# EasyEDA Pro project CanMV-K230-LP4-V3.0-立创文件.epro, schematic CanMV-K230-LP4-V3.0_20240509

## Sheets
1 K230: Create Date: 2025-10-27; Page Name: K230; Project Name: CanMV-K230; Schematic Name: CanMV-K230-LP4-V3.0_7; Update Date: 2025-10-27; Company: 嘉立创EDA; Page Size: A3; Version: V1.0
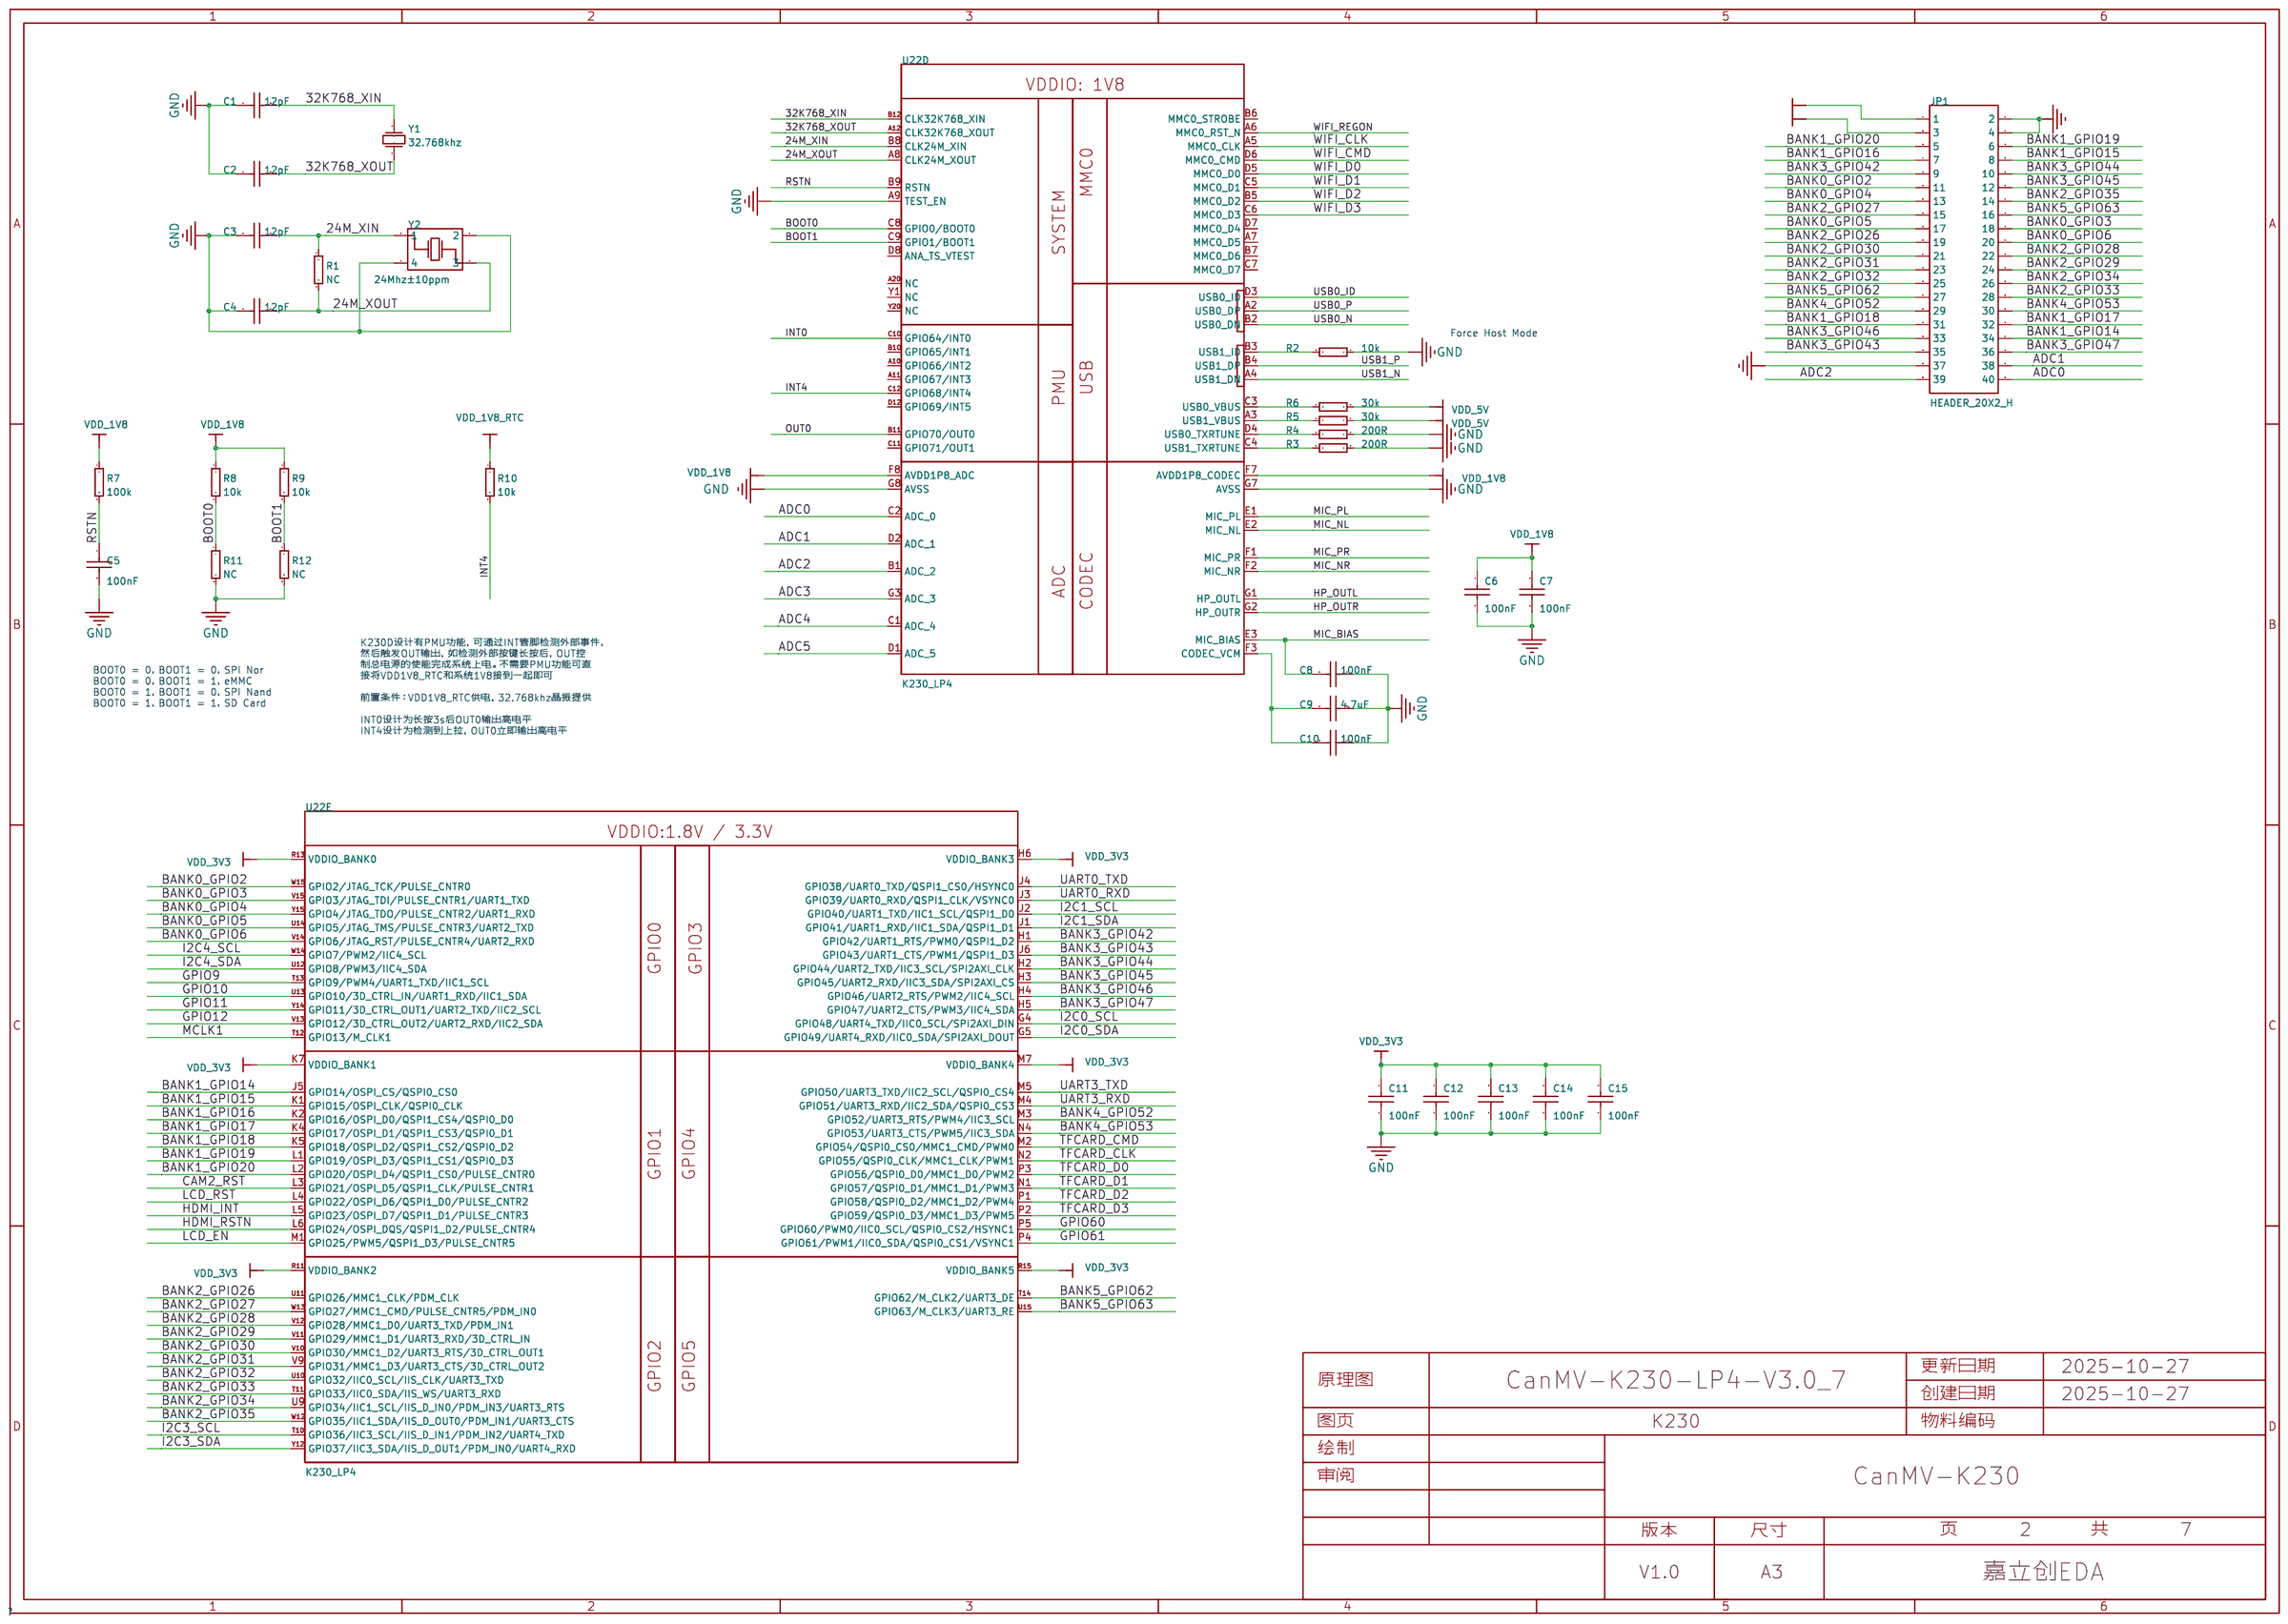
[diagram p0: K230]
2 LPDDR4: Page Name: LPDDR4
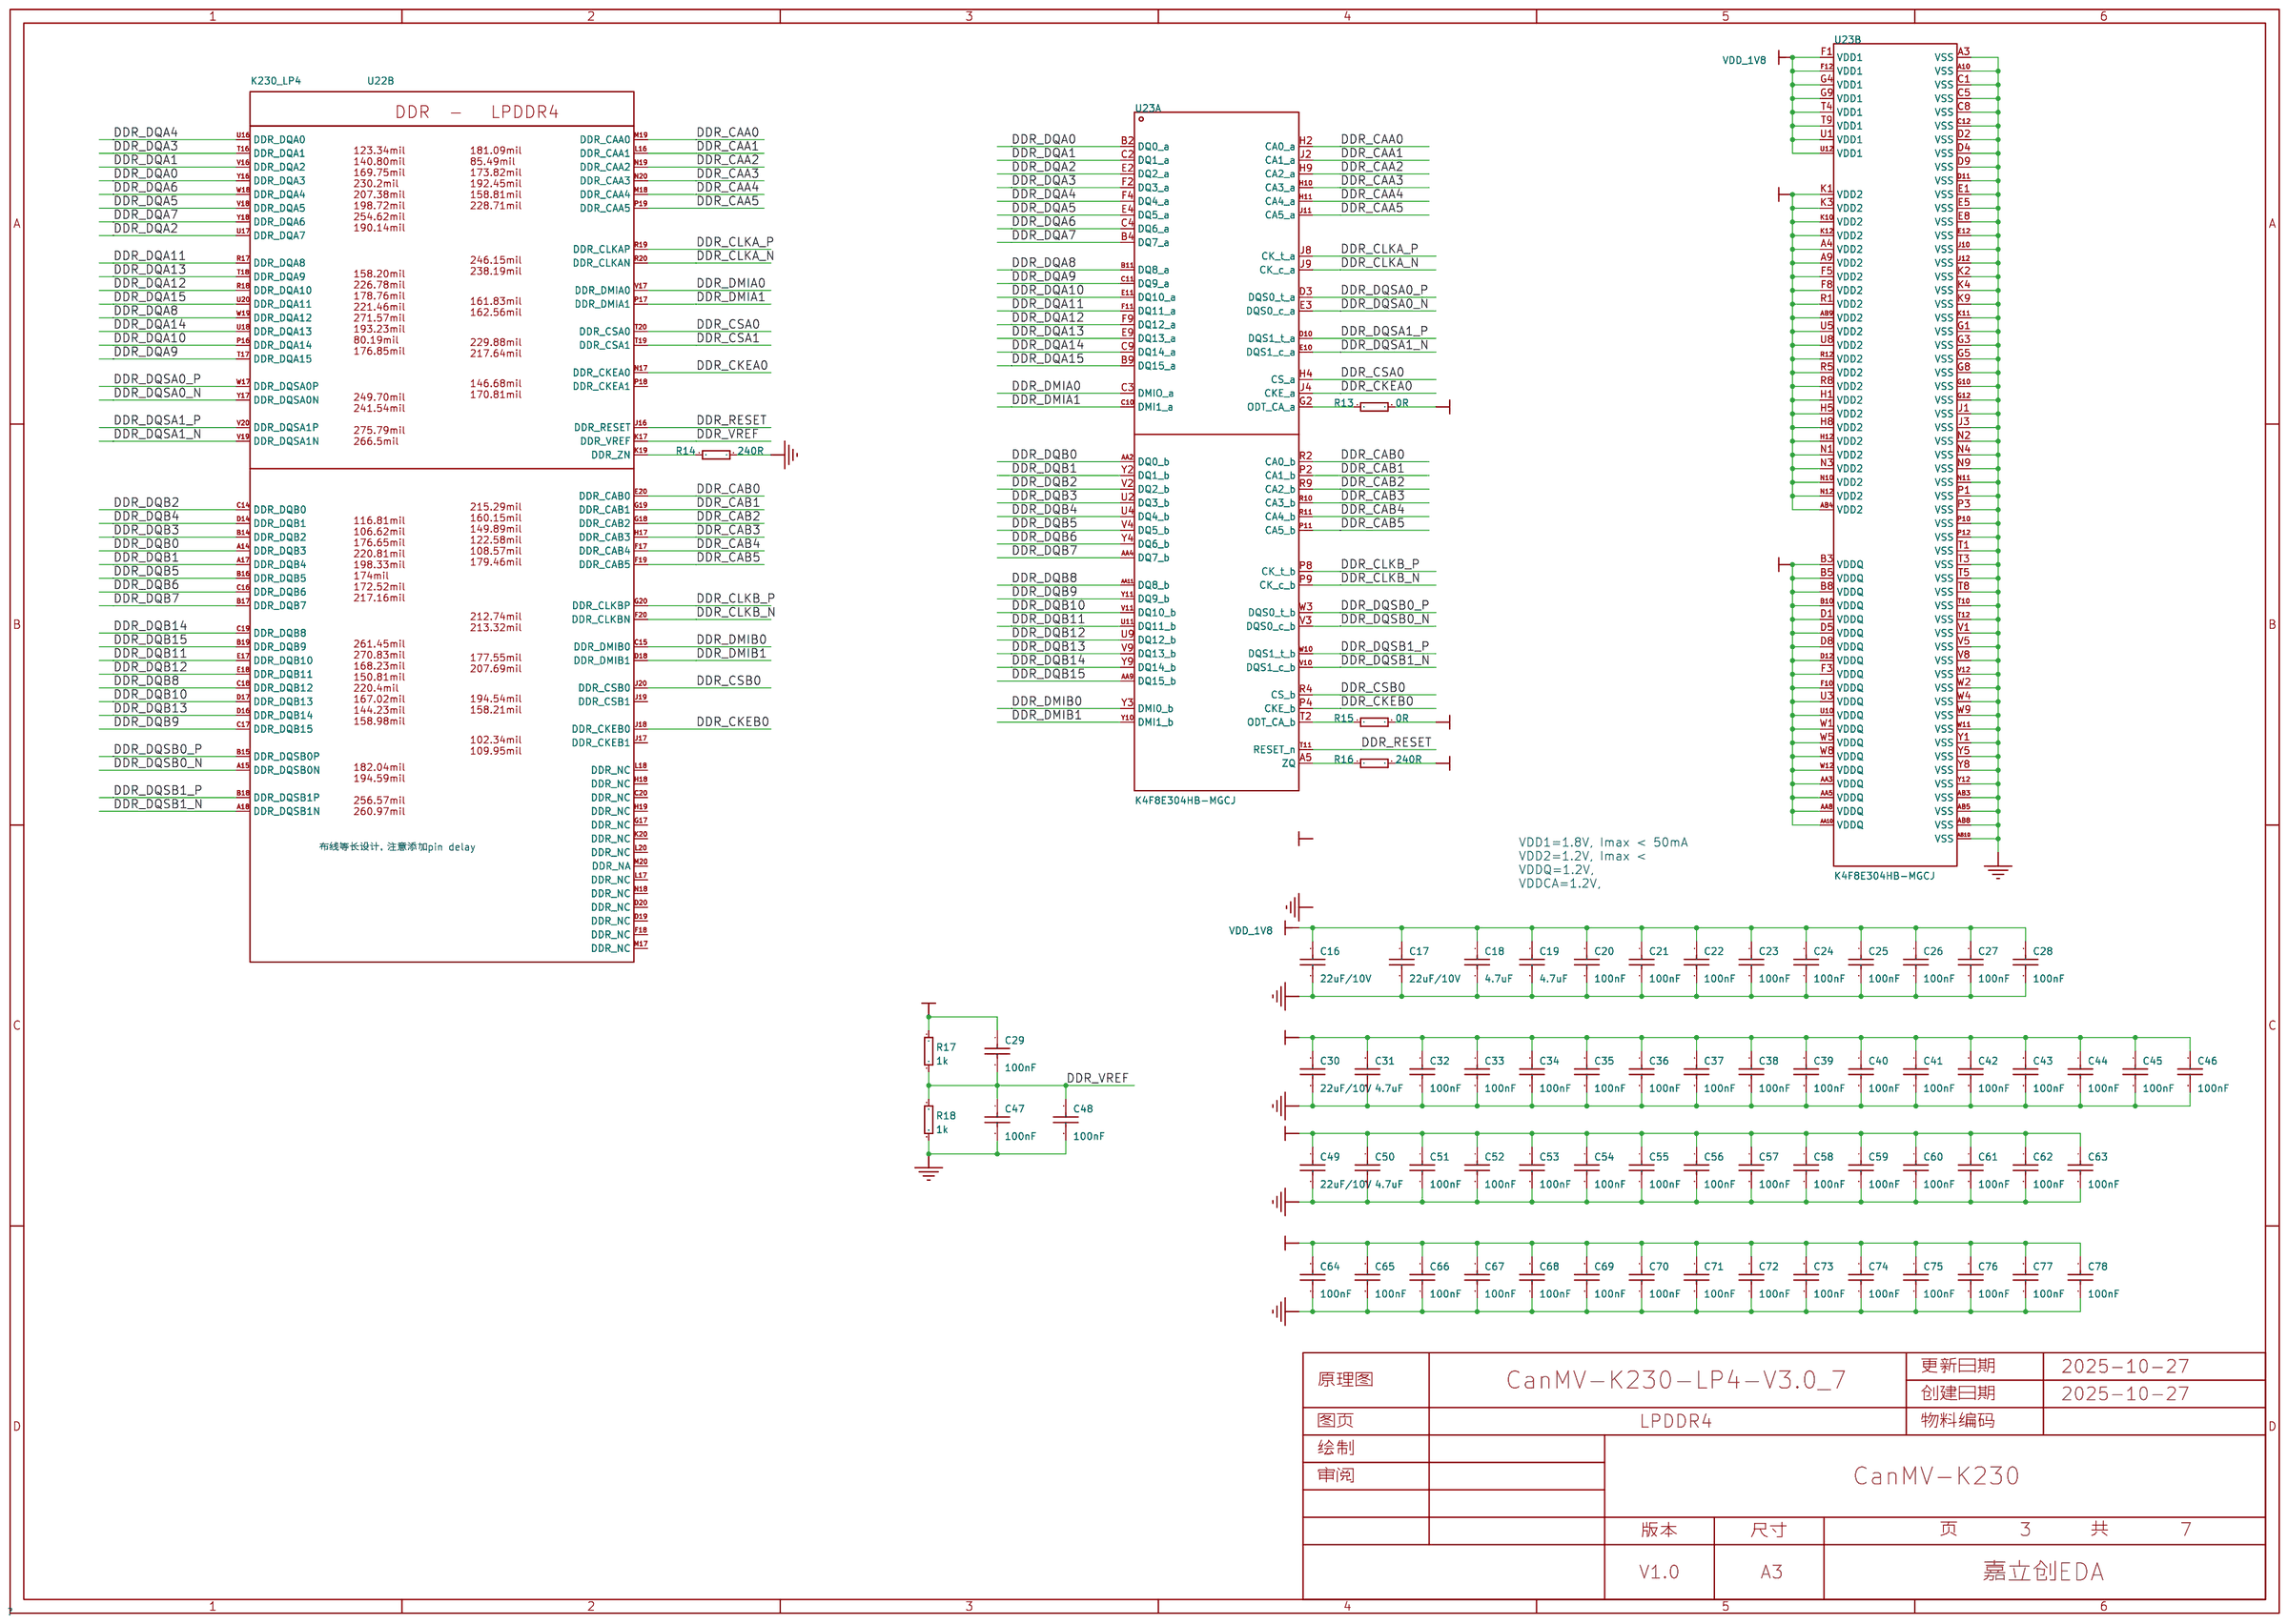
[diagram p1: LPDDR4]
3 Power-K230: Page Name: Power-K230
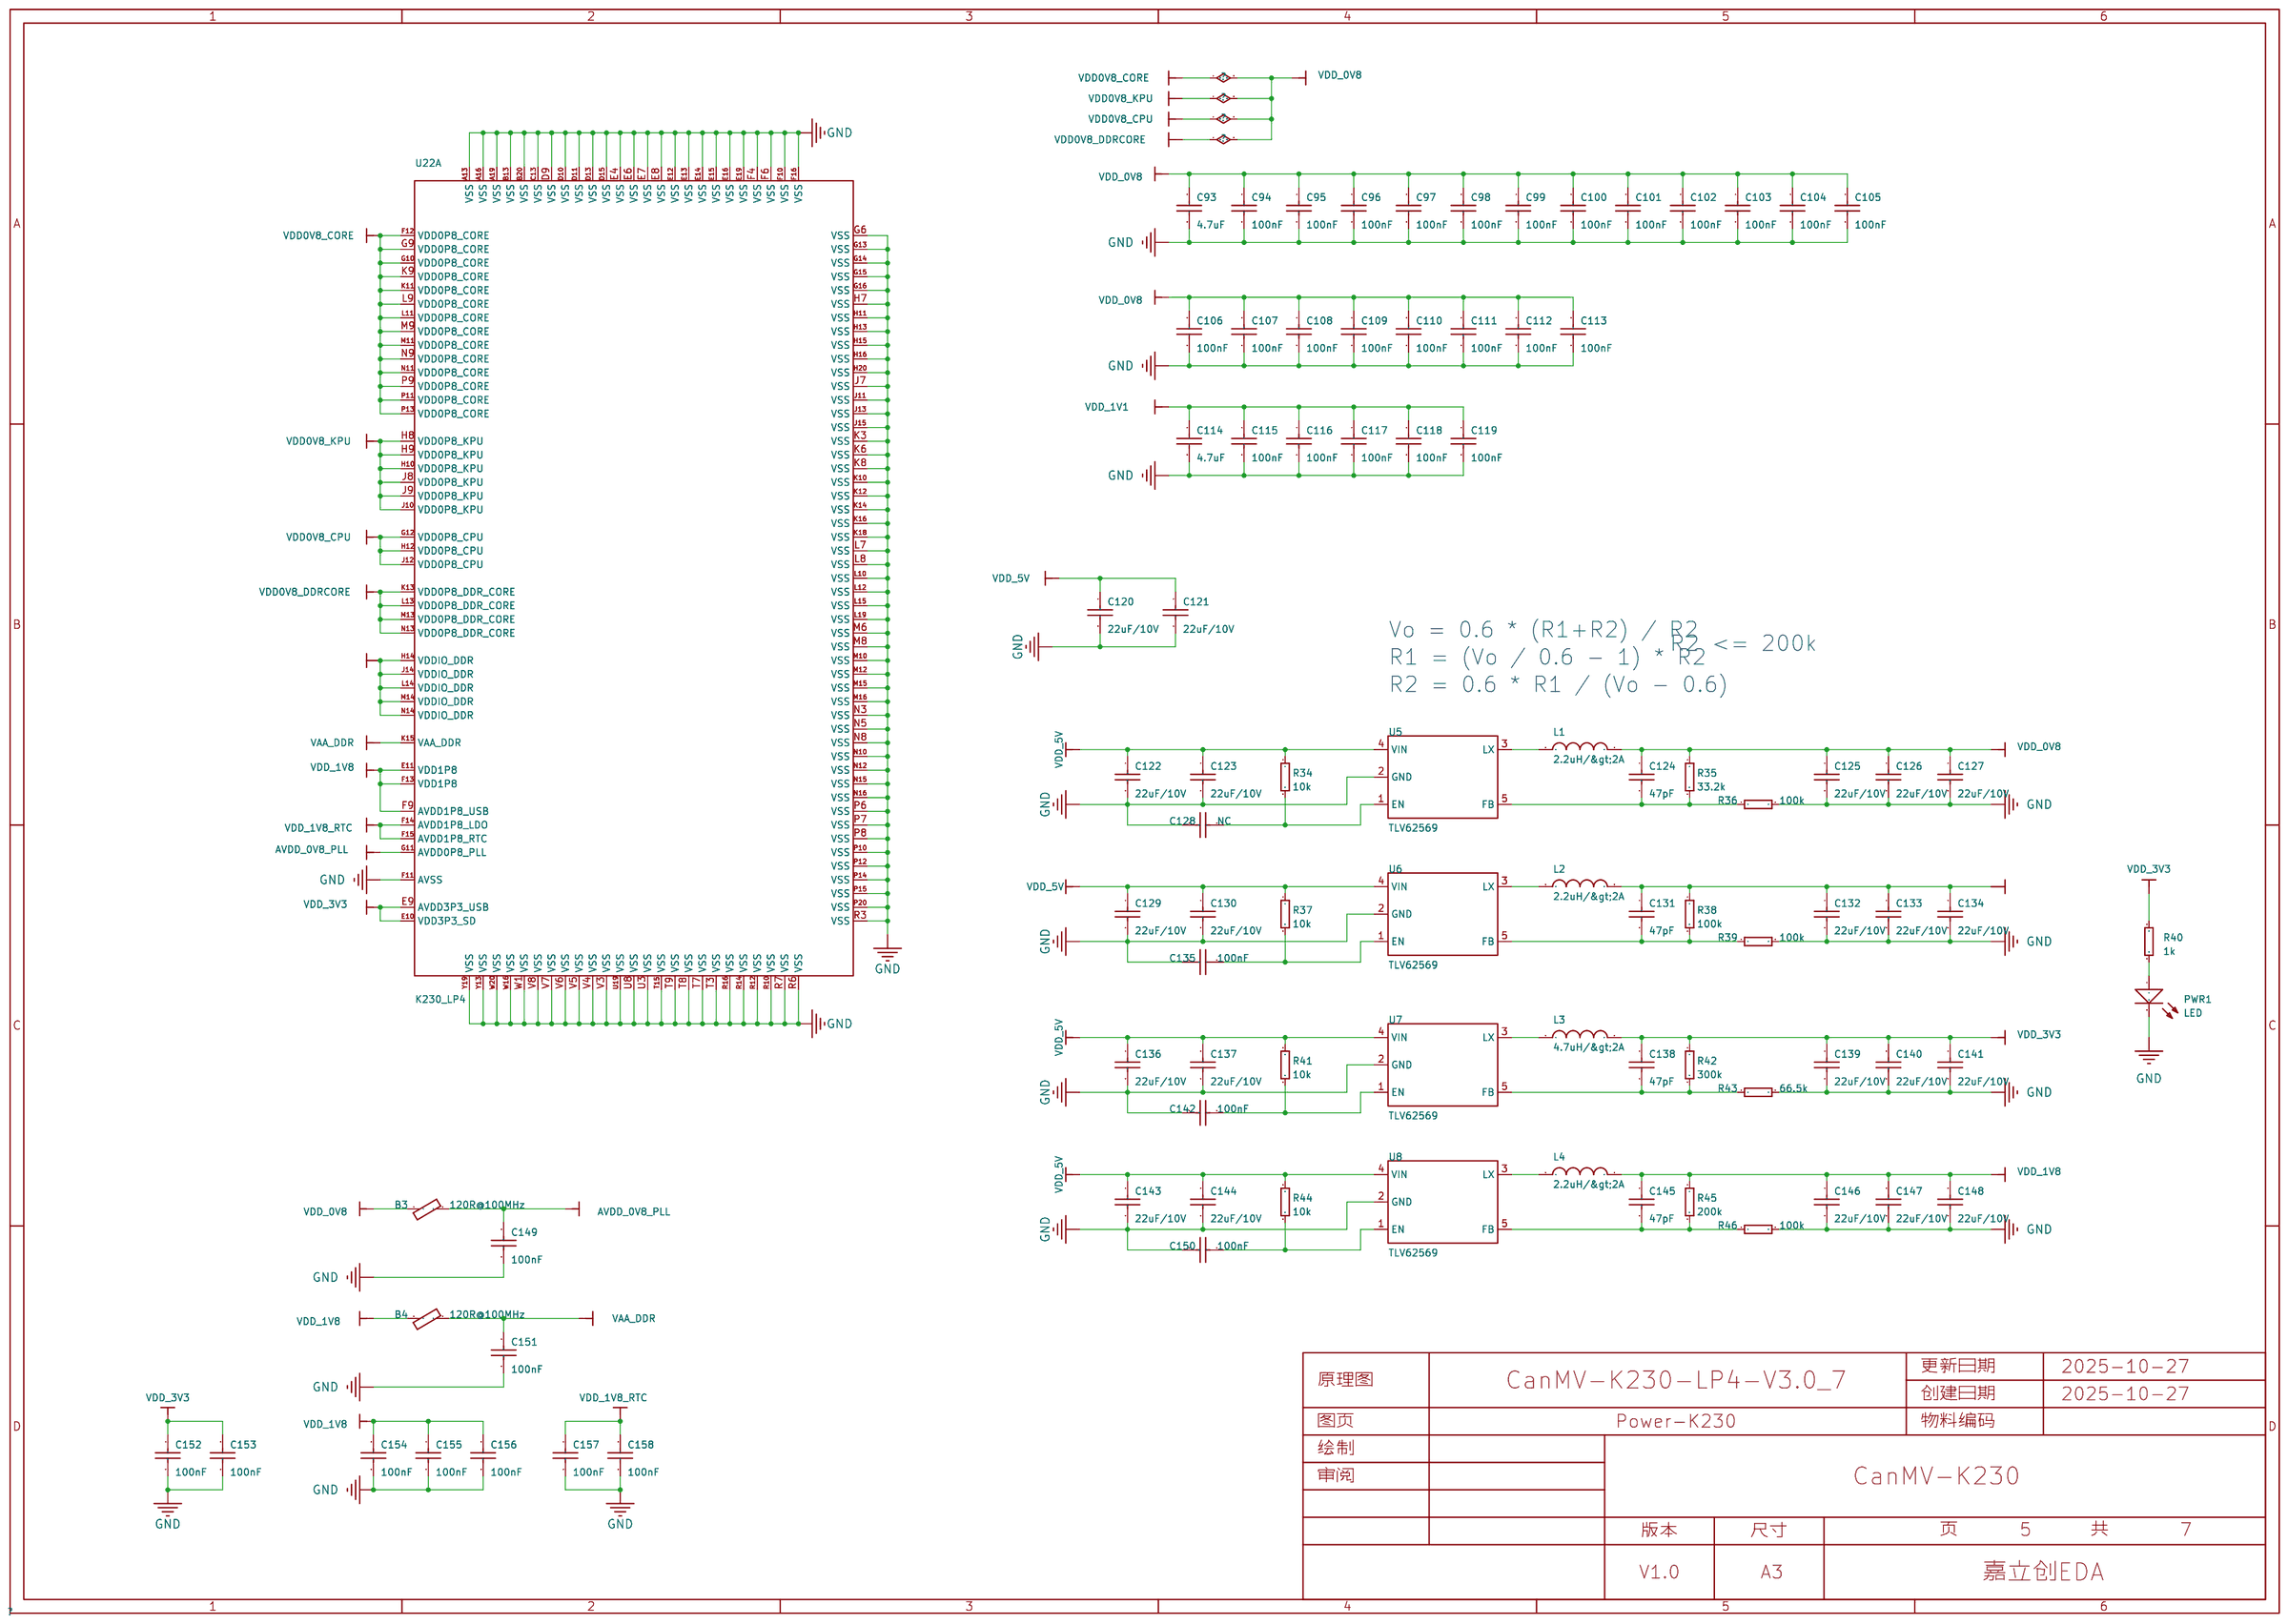
[diagram p2: Power-K230]
4 Peripherial: Create Date: 2026-07-16; Page Name: Peripherial; Update Date: 2026-07-16
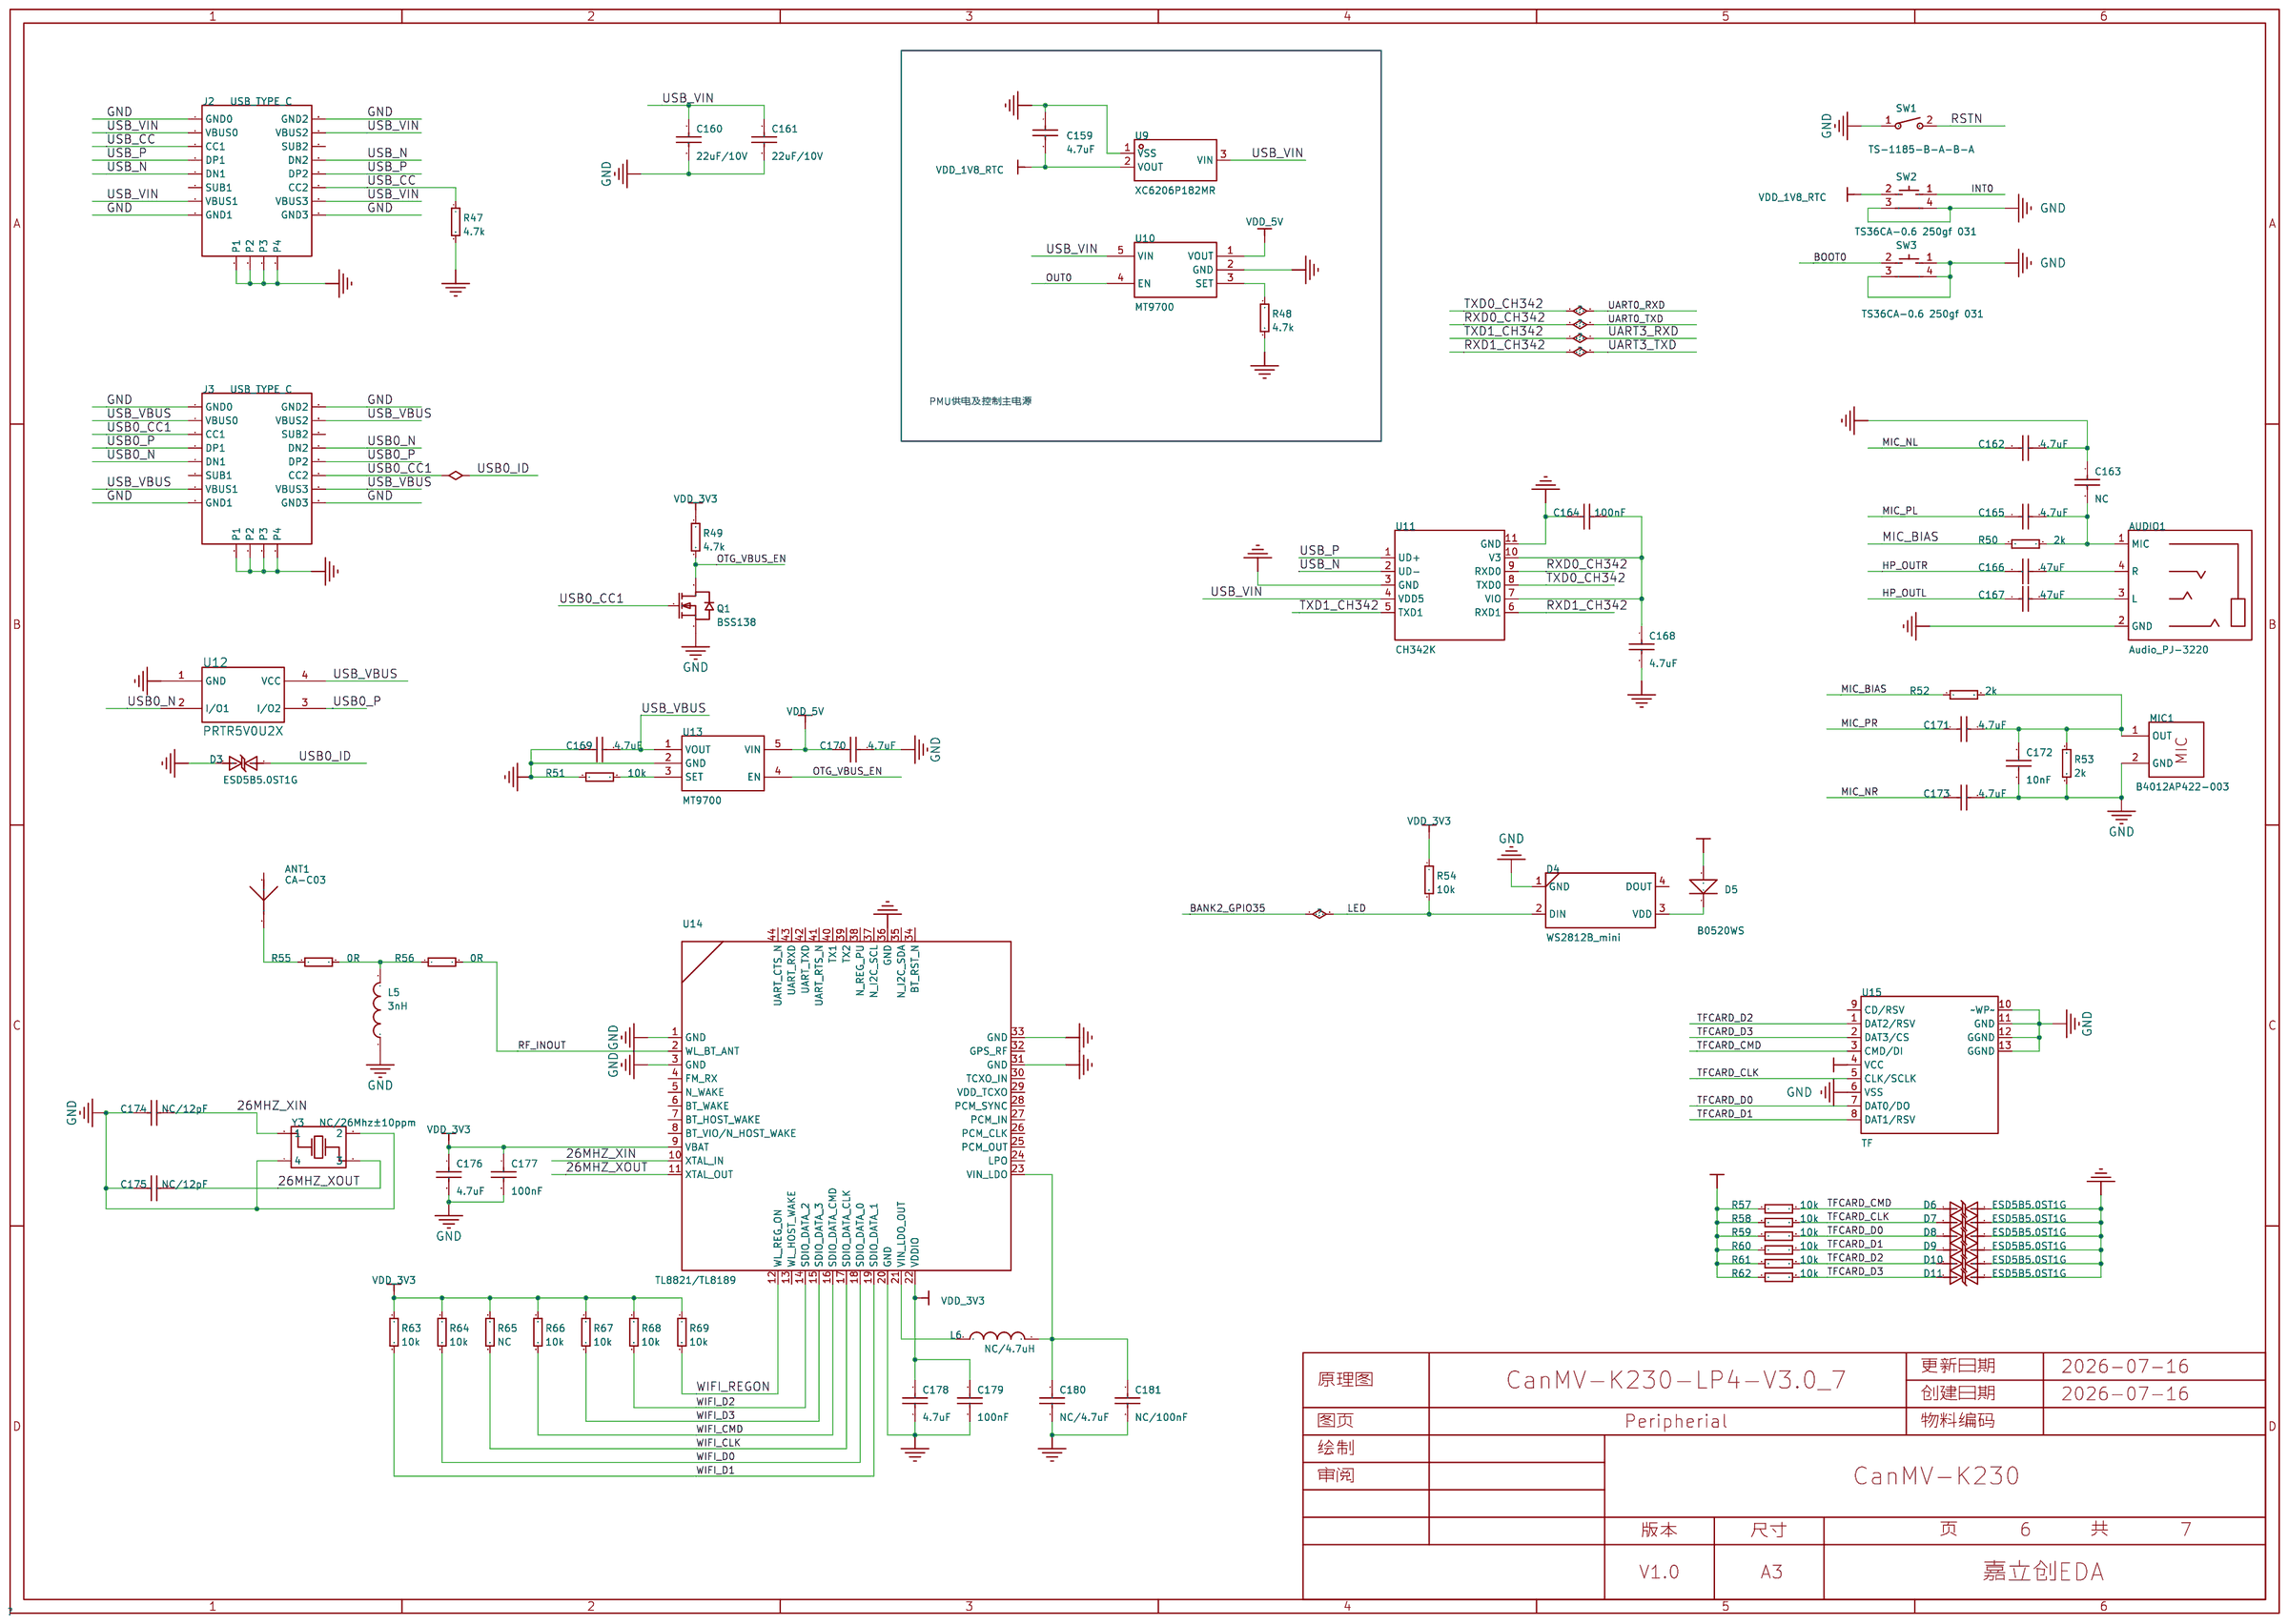
[diagram p3: Peripherial]
5 Video: Page Name: Video
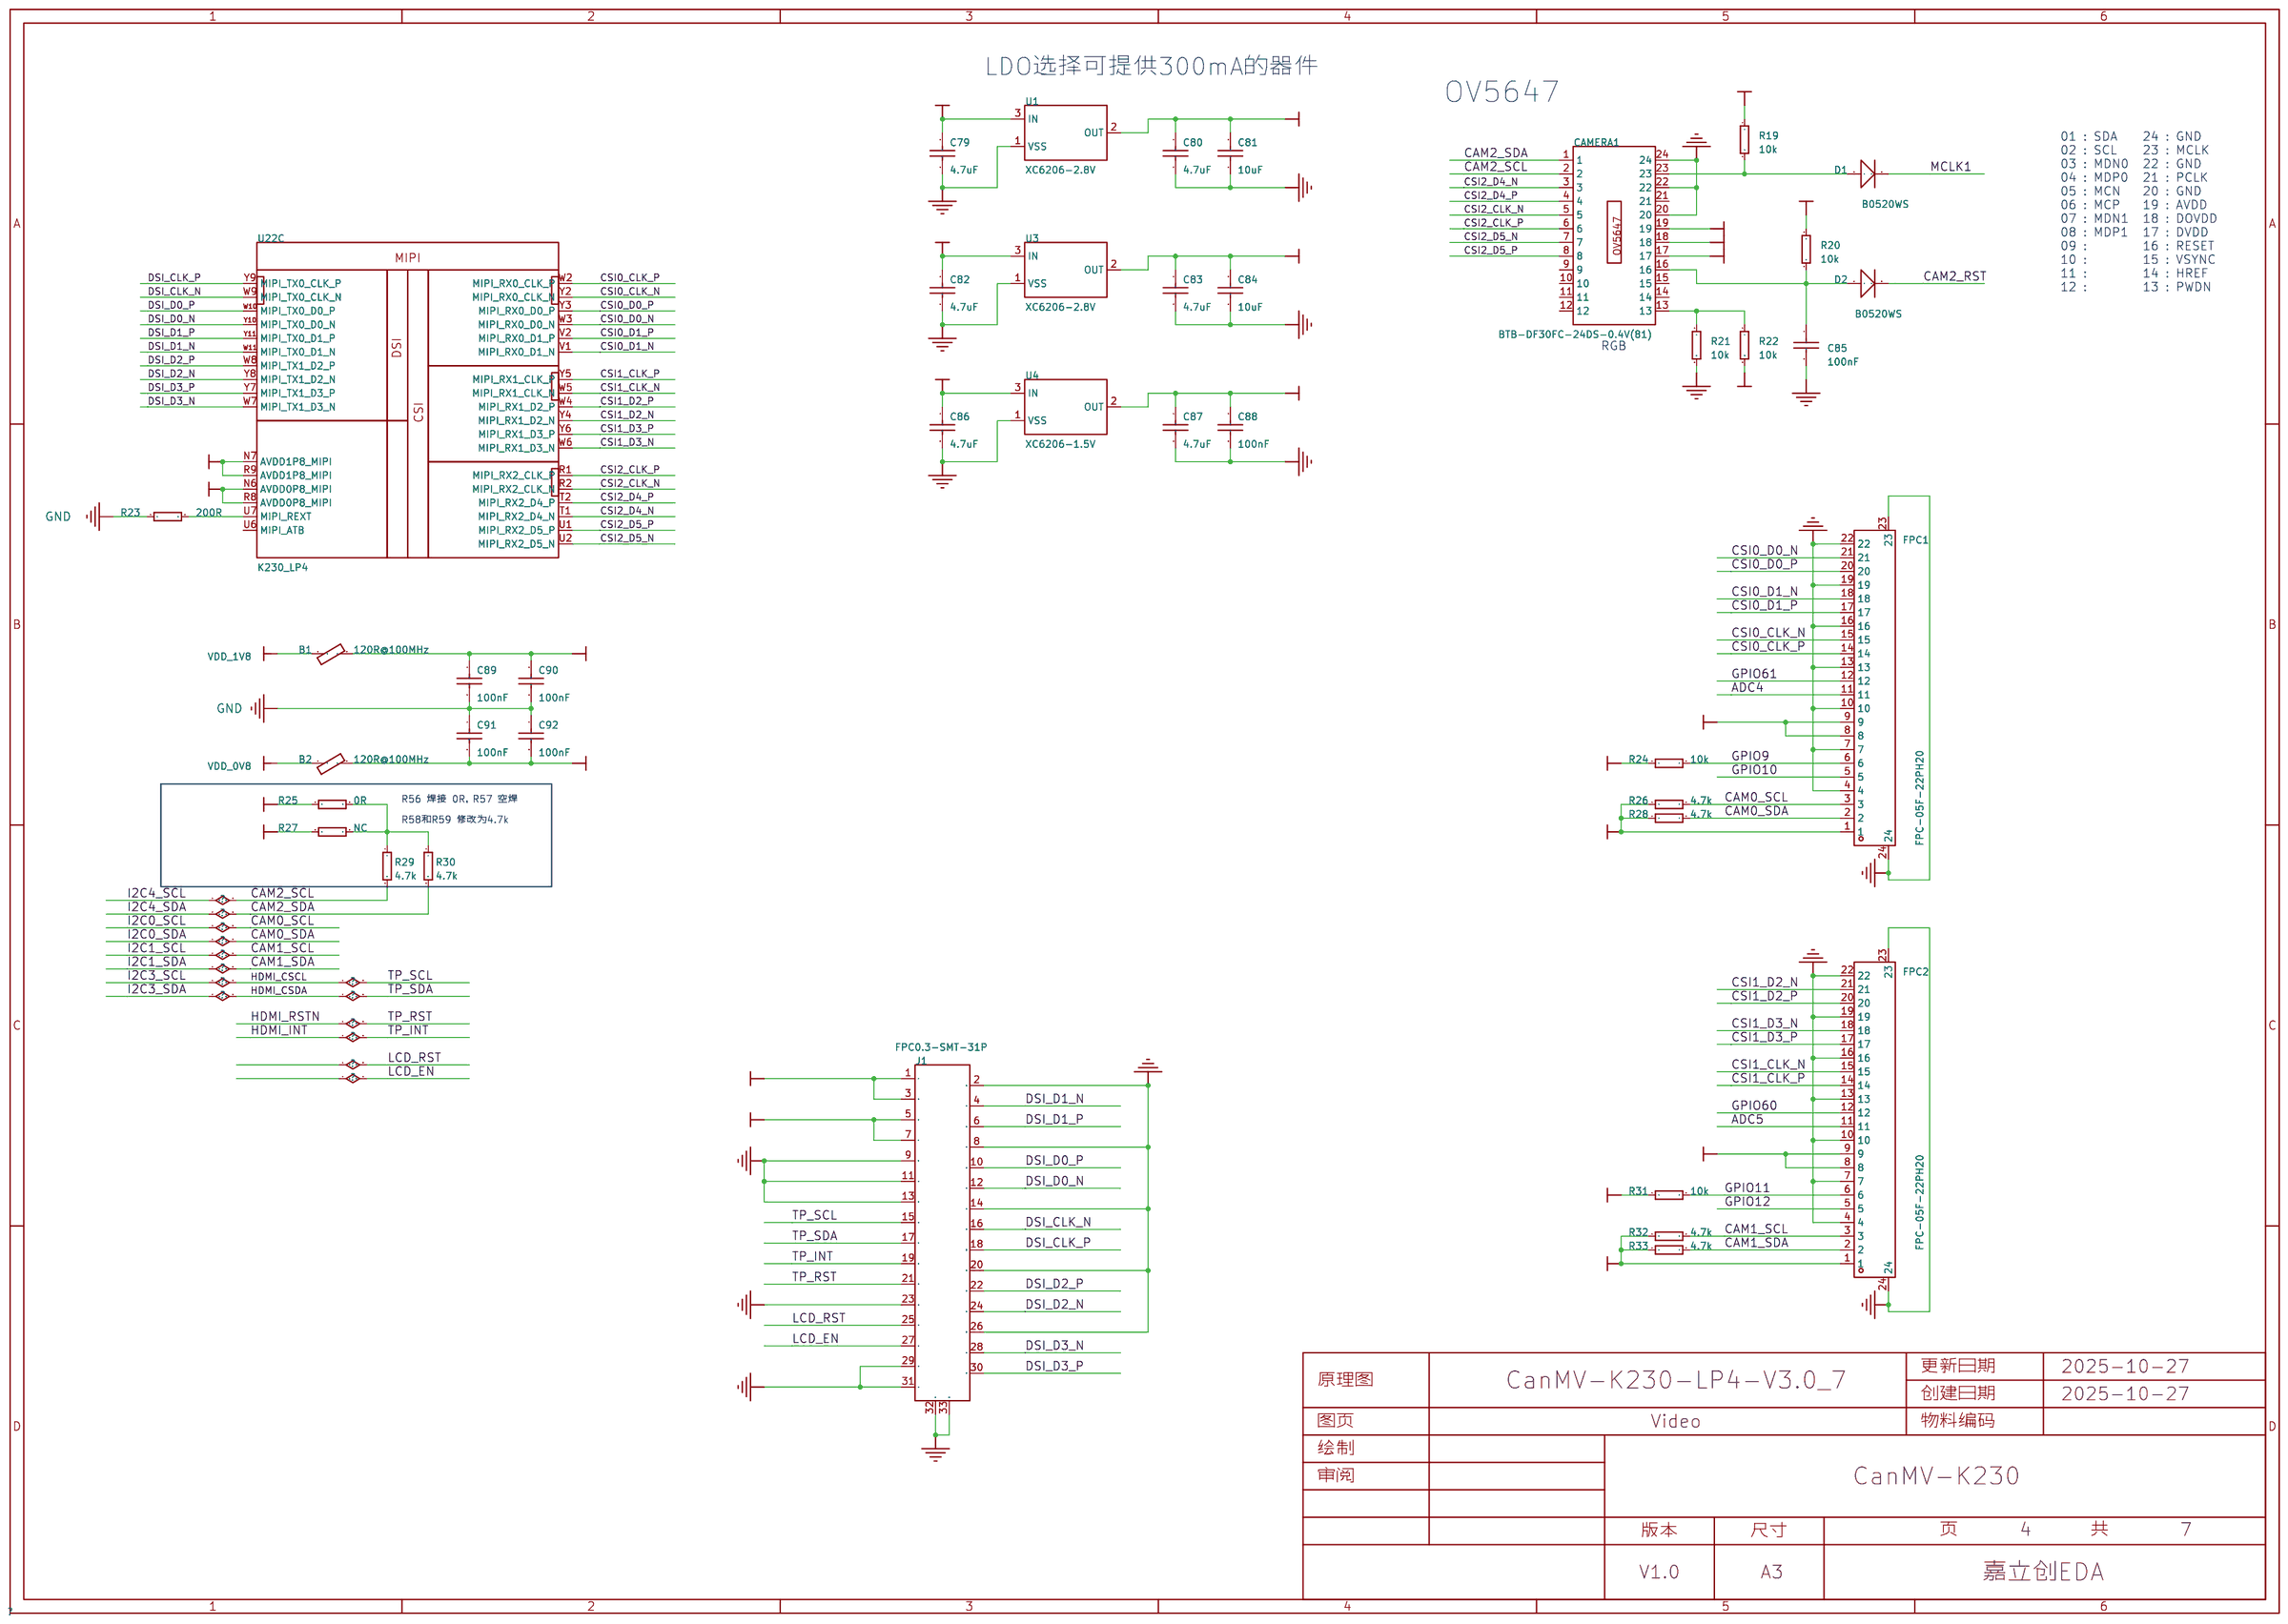
[diagram p4: Video]
6 HDMI+ETH: Page Name: HDMI+ETH; Schematic Name: CanMV-K230-LP4-V3.0_6
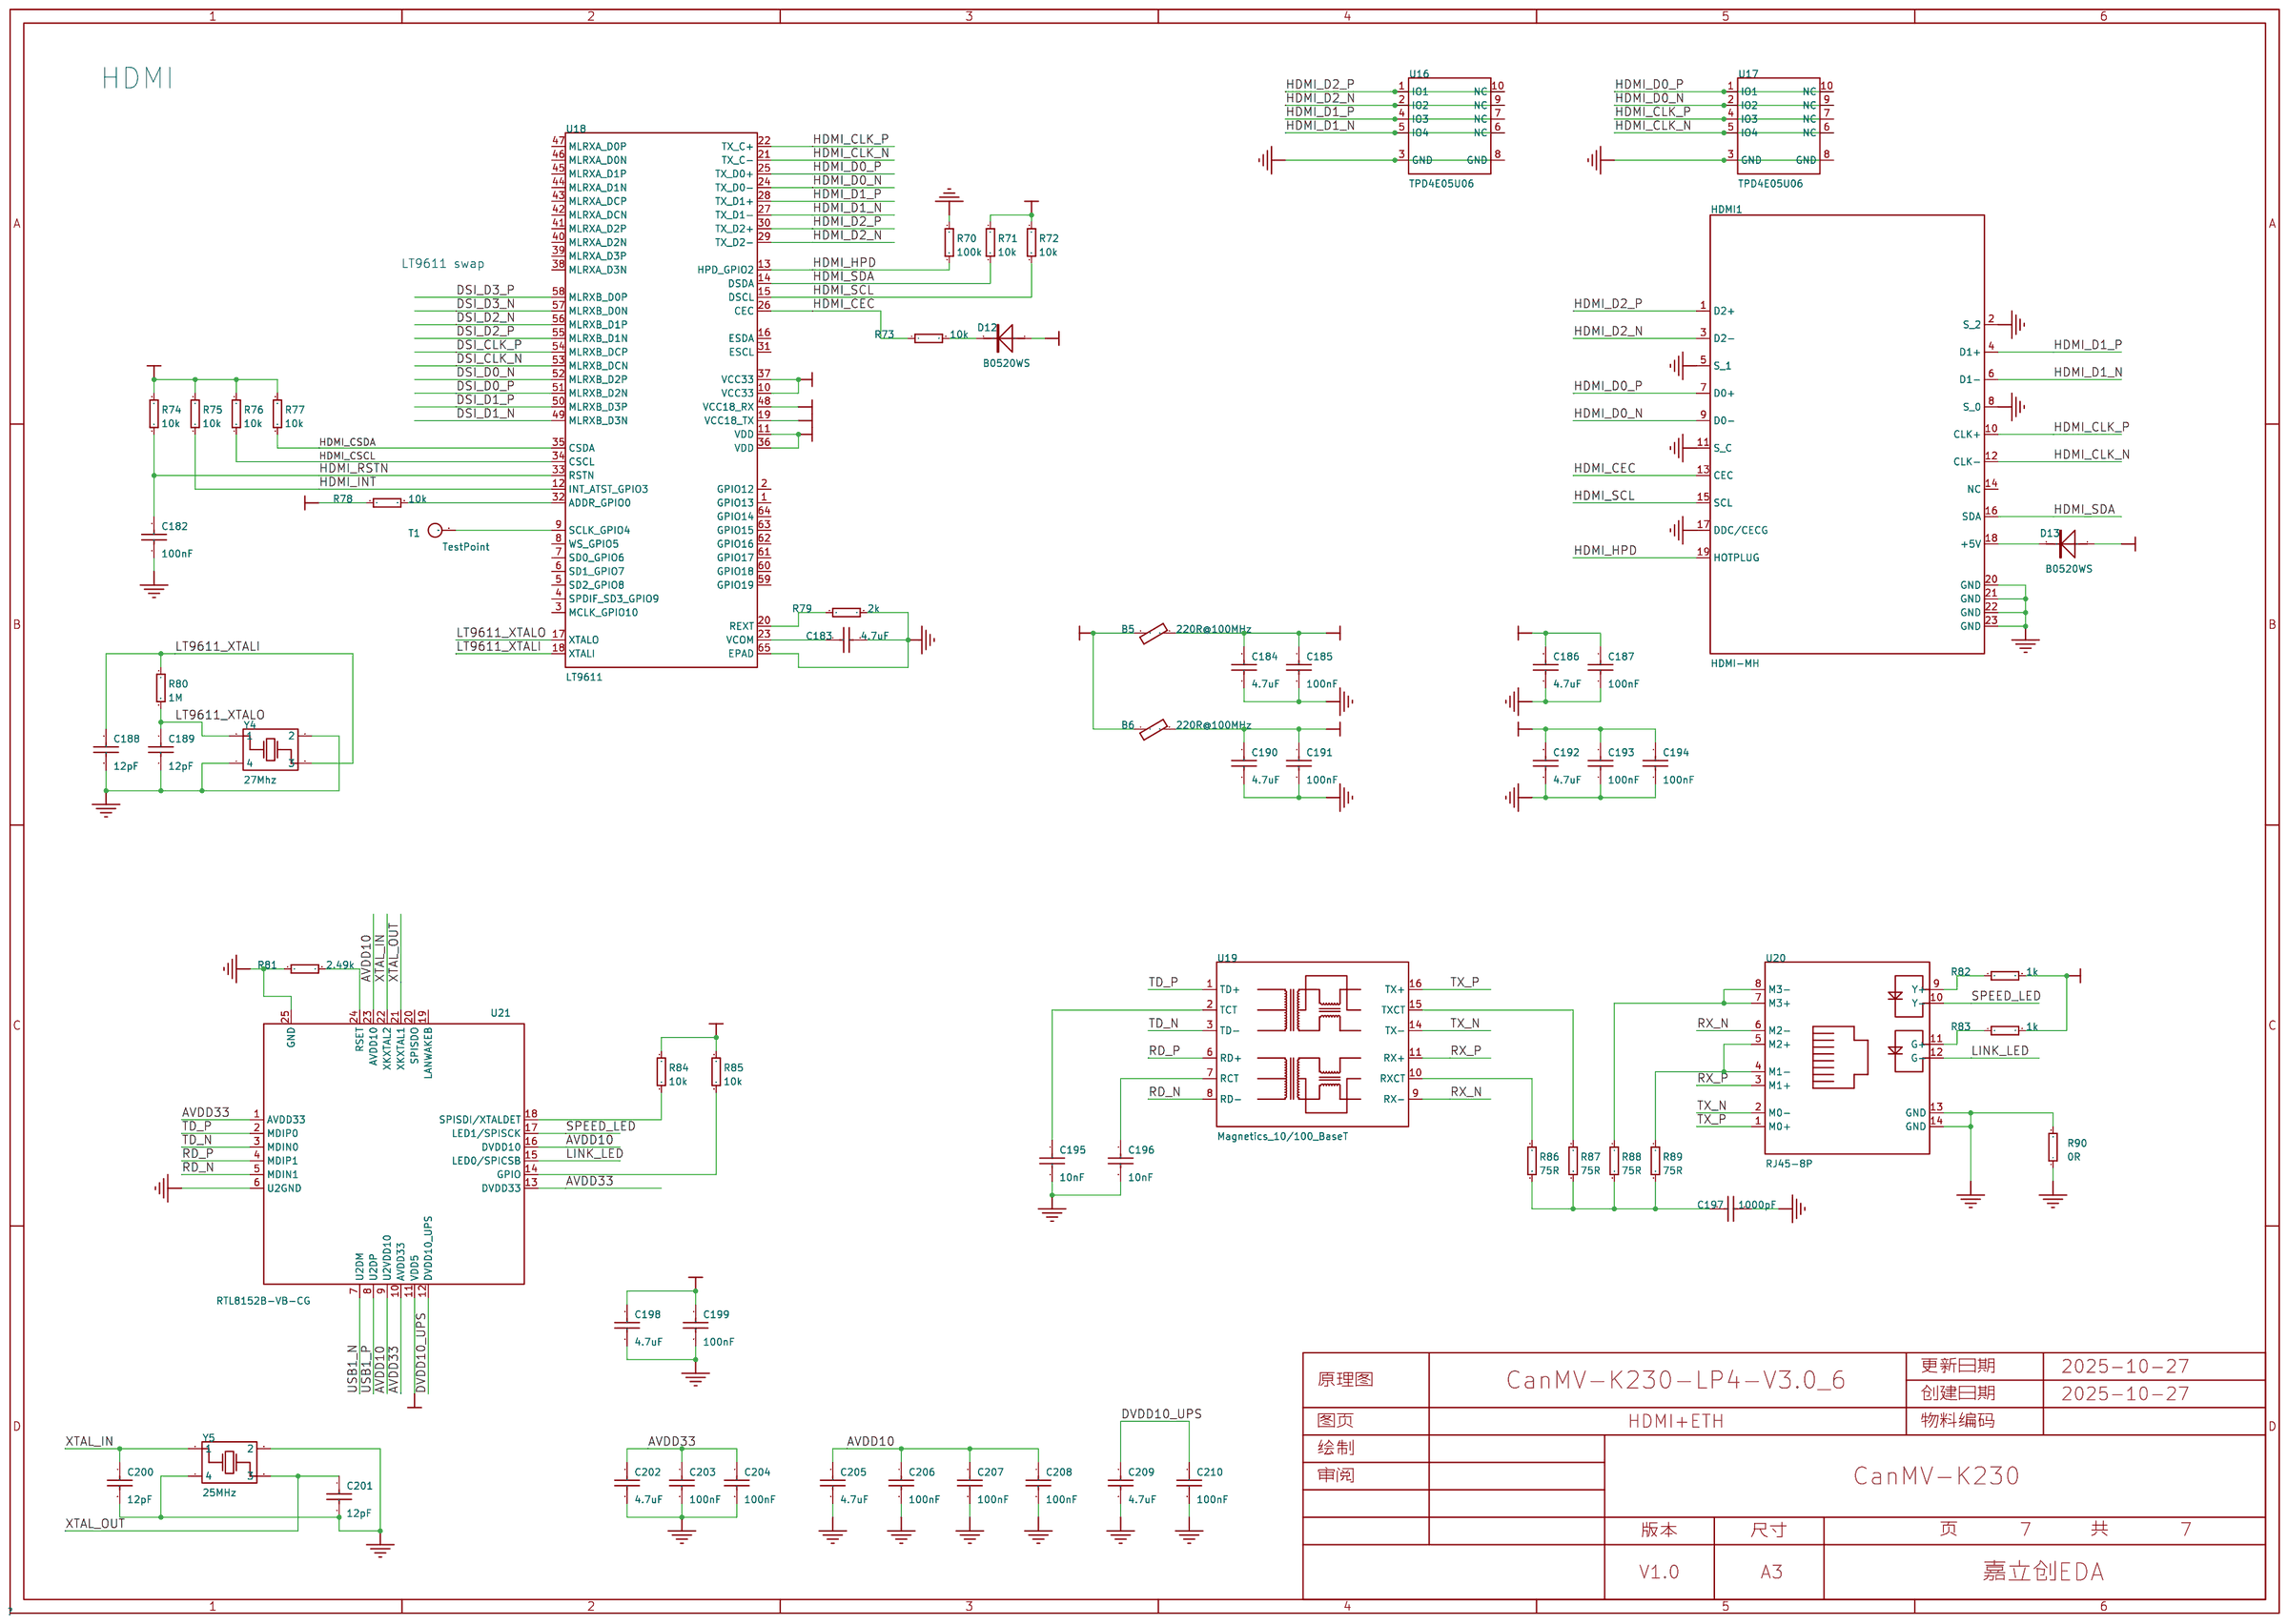
[diagram p5: HDMI+ETH]
7 P1: Page Name: P1; Page Size: A4
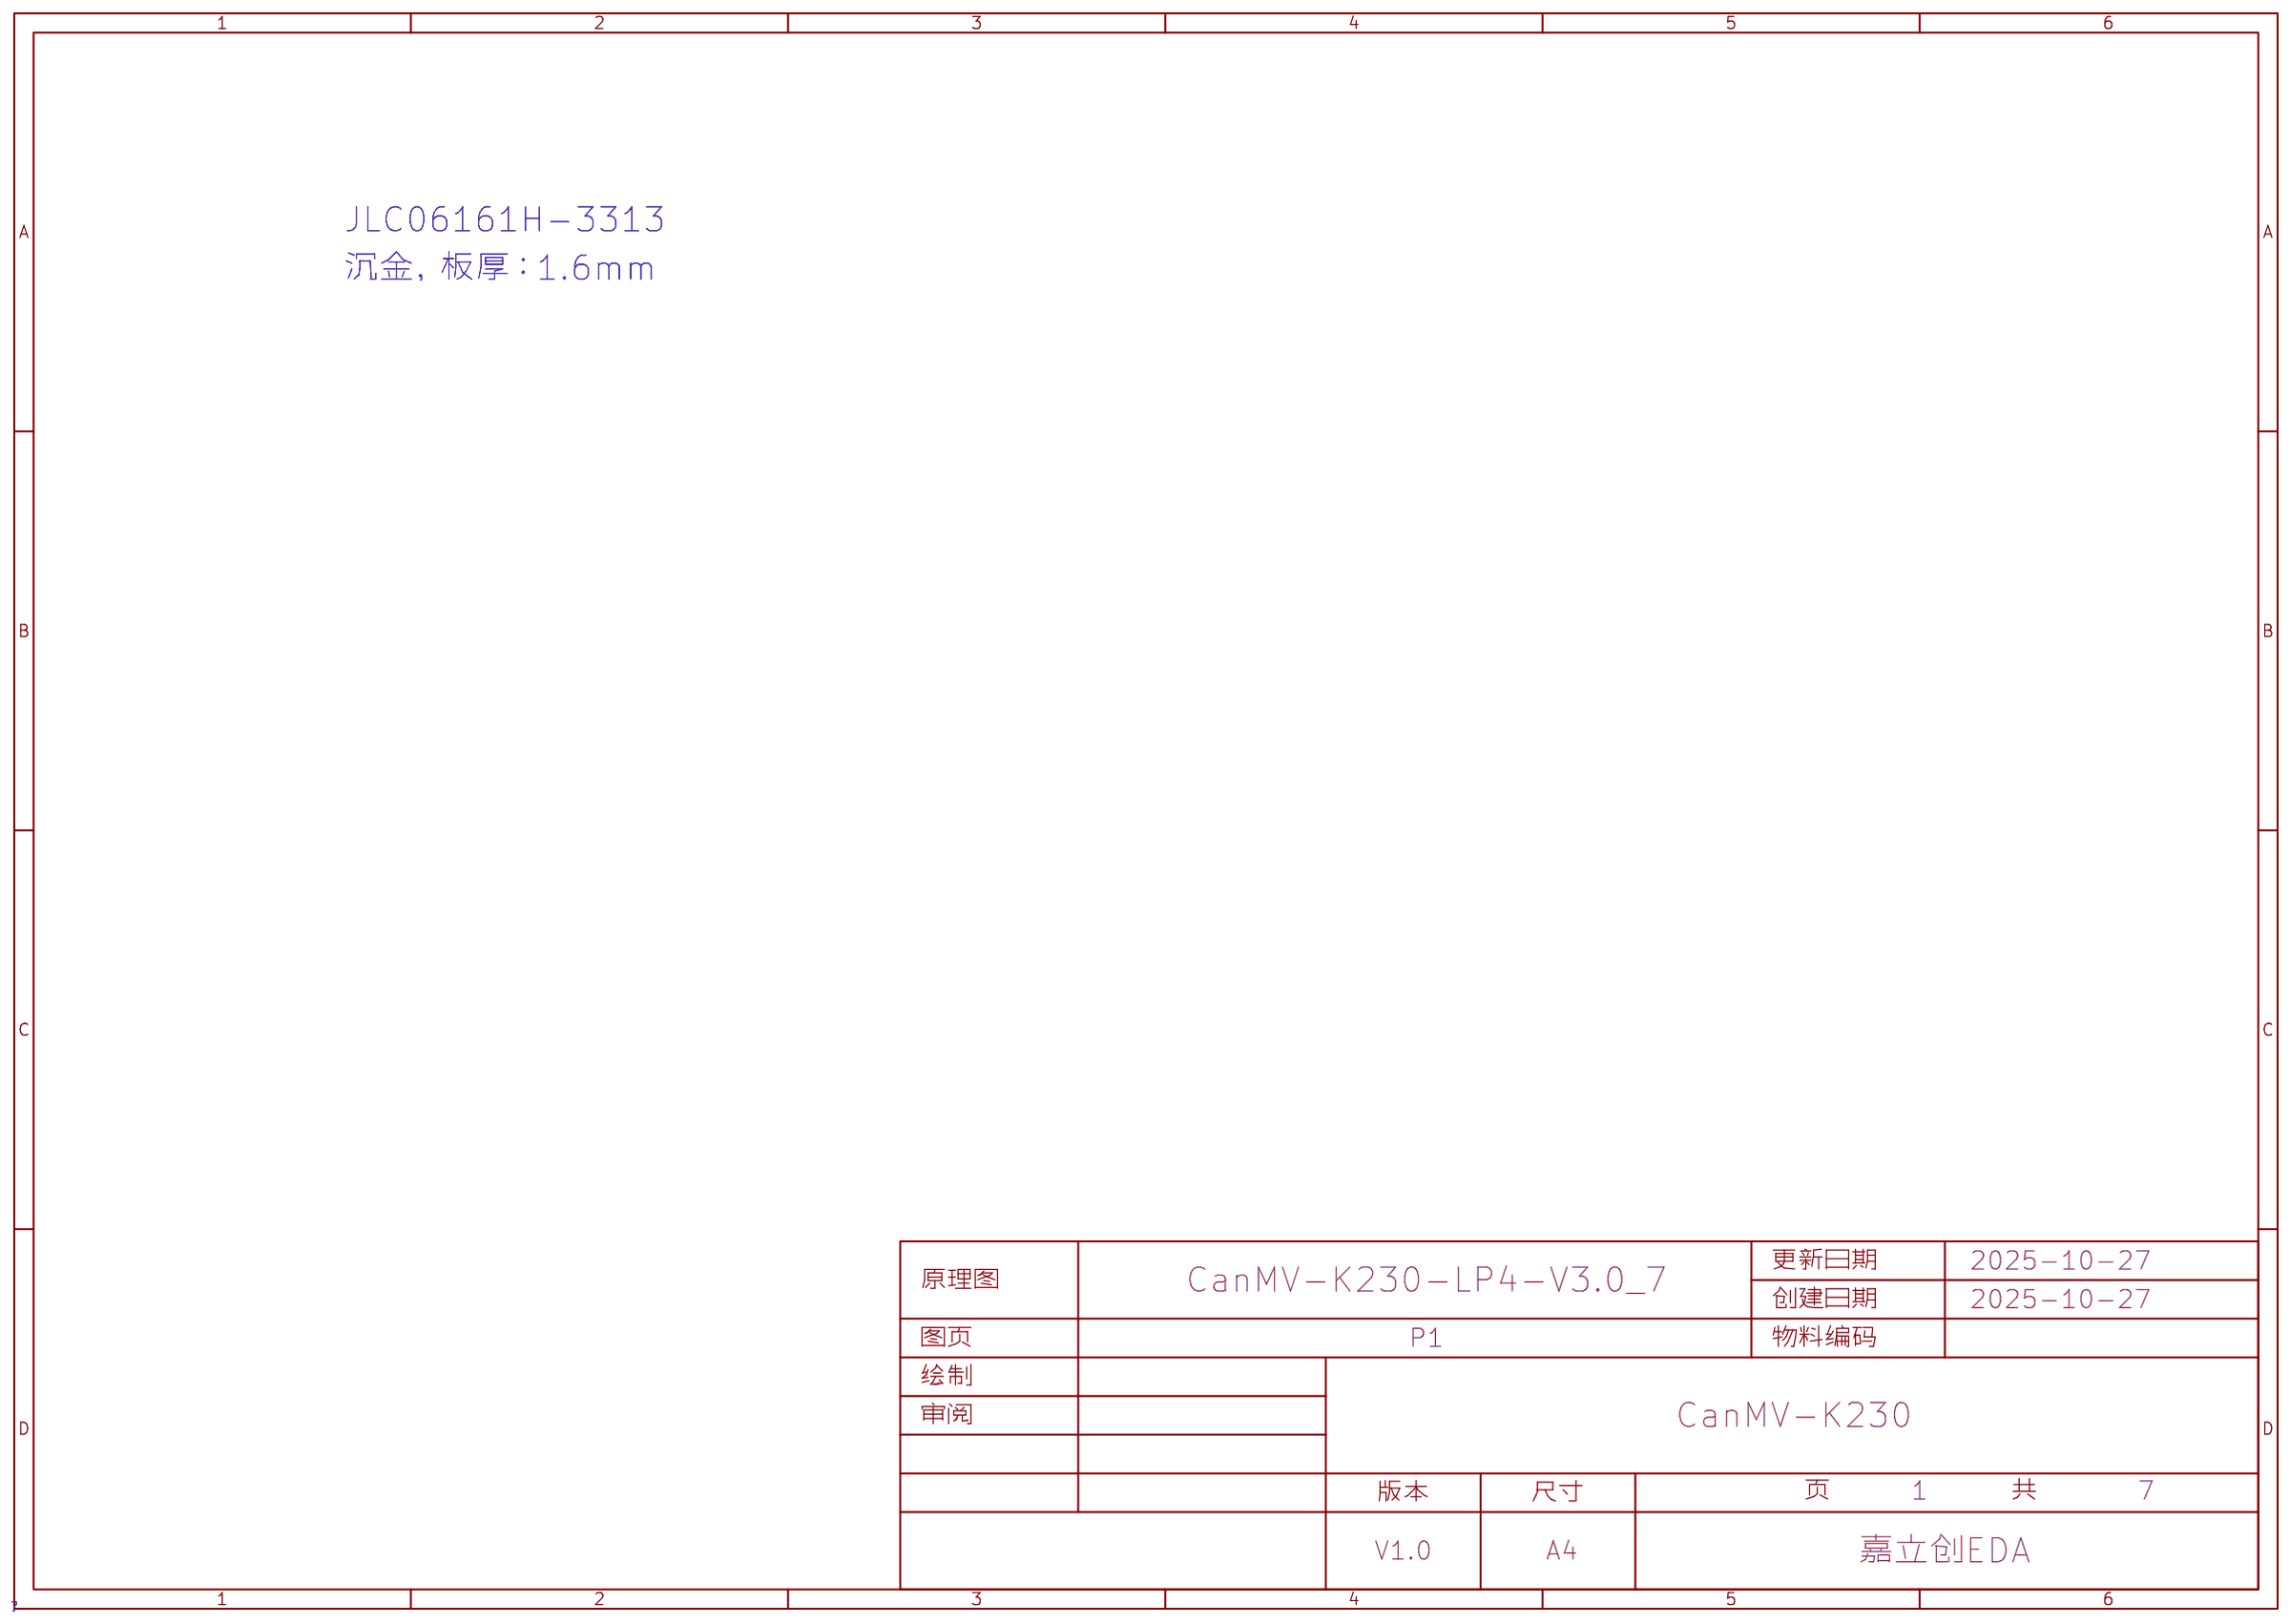
[diagram p6: P1]

## Parts
sheet HDMI+ETH
B5  220R@100MHz  [r0402]
B6  220R@100MHz  [r0402]
C182  100nF  [c0402]
C183  4.7uF  [c0402]
C184  4.7uF  [c0402]
C185  100nF  [c0402]
C186  4.7uF  [c0402]
C187  100nF  [c0402]
C188  12pF  [c0402]
C189  12pF  [c0402]
C190  4.7uF  [c0402]
C191  100nF  [c0402]
C192  4.7uF  [c0402]
C193  100nF  [c0402]
C194  100nF  [c0402]
C195  10nF  [c0402]
C196  10nF  [c0402]
C197  1000pF  [C1206]
C198  4.7uF  [c0402]
C199  100nF  [c0402]
C200  12pF  [c0402]
C201  12pF  [c0402]
C202  4.7uF  [c0402]
C203  100nF  [c0402]
C204  100nF  [c0402]
C205  4.7uF  [c0402]
C206  100nF  [c0402]
C207  100nF  [c0402]
C208  100nF  [c0402]
C209  4.7uF  [c0402]
C210  100nF  [c0402]
D12  B0520WS  [SOD-523]
D13  B0520WS  [SOD-523]
HDMI1  HDMI-MH  [HDMI]
R70  100k  [r0402]
R71  10k  [r0402]
R72  10k  [r0402]
R73  10k  [r0402]
R74  10k  [r0402]
R75  10k  [r0402]
R76  10k  [r0402]
R77  10k  [r0402]
R78  10k  [r0402]
R79  2k  [r0402]
R80  1M  [r0402]
R81  2.49k  [r0402]
R82  1k  [r0402]
R83  1k  [r0402]
R84  10k  [r0402]
R85  10k  [r0402]
R86  75R  [R0603]
R87  75R  [R0603]
R88  75R  [R0603]
R89  75R  [R0603]
R90  0R  [R0603]
T1  TestPoint  [TestPoint_D30]
U16  TPD4E05U06  [DFN_2510_10]
U17  TPD4E05U06  [DFN_2510_10]
U18  LT9611  [QFN_64_7P5X7P5_0P4]
U19  Magnetics_10/100_BaseT  [MAGNETICS_10/100_BASET]
U20  RJ45-8P  [RJ45_RC01812]
U21  RTL8152B-VB-CG  [QFN_24]
Y4  27Mhz  [XTAL_3225]
Y5  25MHz  [XTAL_3225]
sheet K230
C1  12pF  [c0402]
C2  12pF  [c0402]
C3  12pF  [c0402]
C4  12pF  [c0402]
C5  100nF  [c0402]
C6  100nF  [C0201]
C7  100nF  [C0201]
C8  100nF  [c0402]
C9  4.7uF  [c0402]
C10  100nF  [c0402]
C11  100nF  [C0201]
C12  100nF  [C0201]
C13  100nF  [C0201]
C14  100nF  [C0201]
C15  100nF  [C0201]
JP1  HEADER_20X2_H  [HEADER_2x20_H_F_2.54MM]
R1  NC  [r0402]
R2  10k  [r0402]
R3  200R  [r0402]
R4  200R  [r0402]
R5  30k  [r0402]
R6  30k  [r0402]
R7  100k  [r0402]
R8  10k  [r0402]
R9  10k  [r0402]
R10  10k  [r0402]
R11  NC  [r0402]
R12  NC  [r0402]
U22  K230_LP4  [K230]  (sections 1,2,3,4,5)
Y1  32.768khz  [CRYSTAL-SMD_L3.2-W1.5_RT3215]
Y2  24Mhz±10ppm  [XTAL_3225]
sheet LPDDR4
C16  22uF/10V  [c0603]
C17  22uF/10V  [c0603]
C18  4.7uF  [c0402]
C19  4.7uF  [c0402]
C20  100nF  [c0402]
C21  100nF  [c0402]
C22  100nF  [c0402]
C23  100nF  [c0402]
C24  100nF  [c0402]
C25  100nF  [C0201]
C26  100nF  [C0201]
C27  100nF  [C0201]
C28  100nF  [C0201]
C29  100nF  [c0402]
C30  22uF/10V  [c0603]
C31  4.7uF  [c0402]
C32  100nF  [C0201]
C33  100nF  [C0201]
C34  100nF  [C0201]
C35  100nF  [C0201]
C36  100nF  [C0201]
C37  100nF  [C0201]
C38  100nF  [C0201]
C39  100nF  [C0201]
C40  100nF  [C0201]
C41  100nF  [C0201]
C42  100nF  [C0201]
C43  100nF  [C0201]
C44  100nF  [C0201]
C45  100nF  [C0201]
C46  100nF  [C0201]
C47  100nF  [c0402]
C48  100nF  [C0201]
C49  22uF/10V  [c0603]
C50  4.7uF  [c0402]
C51  100nF  [C0201]
C52  100nF  [C0201]
C53  100nF  [C0201]
C54  100nF  [C0201]
C55  100nF  [C0201]
C56  100nF  [C0201]
C57  100nF  [C0201]
C58  100nF  [C0201]
C59  100nF  [C0201]
C60  100nF  [C0201]
C61  100nF  [C0201]
C62  100nF  [C0201]
C63  100nF  [C0201]
C64  100nF  [c0402]
C65  100nF  [c0402]
C66  100nF  [c0402]
C67  100nF  [c0402]
C68  100nF  [c0402]
C69  100nF  [c0402]
C70  100nF  [c0402]
C71  100nF  [c0402]
C72  100nF  [C0201]
C73  100nF  [C0201]
C74  100nF  [C0201]
C75  100nF  [C0201]
C76  100nF  [C0201]
C77  100nF  [C0201]
C78  100nF  [C0201]
R13  0R  [r0402]
R14  240R  [r0402]
R15  0R  [r0402]
R16  240R  [r0402]
R17  1k  [r0402]
R18  1k  [r0402]
U23  K4F8E304HB-MGCJ  [BGA-200_L15.0-W10.0_K4F8E304HB-MGCJ]  (sections A,B)
sheet Peripherial
ANT1  CA-C03  [ANT-SMD_CA-C03]
AUDIO1  Audio_PJ-3220  [AUDIO_JACK_PJ-3220-Y]
C159  4.7uF  [c0402]
C160  22uF/10V  [c0603]
C161  22uF/10V  [c0603]
C162  4.7uF  [c0402]
C163  NC  [c0402]
C164  100nF  [c0402]
C165  4.7uF  [c0402]
C166  47uF  [C1206]
C167  47uF  [C1206]
C168  4.7uF  [c0402]
C169  4.7uF  [c0402]
C170  4.7uF  [c0402]
C171  4.7uF  [c0402]
C172  10nF  [c0402]
C173  4.7uF  [c0402]
C174  NC/12pF  [c0402]
C175  NC/12pF  [c0402]
C176  4.7uF  [c0402]
C177  100nF  [c0402]
C178  4.7uF  [c0402]
C179  100nF  [c0402]
C180  NC/4.7uF  [c0402]
C181  NC/100nF  [c0402]
D3  ESD5B5.0ST1G  [SOD-523]
D4  WS2812B_mini  [LED-SMD_4P-L3.5-W3.5-TL_WS2812B]
D5  B0520WS  [SOD-523]
D6  ESD5B5.0ST1G  [SOD-523]
D7  ESD5B5.0ST1G  [SOD-523]
D8  ESD5B5.0ST1G  [SOD-523]
D9  ESD5B5.0ST1G  [SOD-523]
D10  ESD5B5.0ST1G  [SOD-523]
D11  ESD5B5.0ST1G  [SOD-523]
J2  USB_TYPE_C  [USB_TYPE_C]
J3  USB_TYPE_C  [USB_TYPE_C]
L5  3nH  [r0402]
L6  NC/4.7uH  [252012_NSK]
MIC1  B4012AP422-003  [MIC-TH_BD4.0-P1.40-D0.3-L]
Q1  BSS138  [SOT-23-3_L2.9-W1.3-P1.90-LS2.4-BR]
R47  4.7k  [r0402]
R48  4.7k  [r0402]
R49  4.7k  [r0402]
R50  2k  [r0402]
R51  10k  [r0402]
R52  2k  [r0402]
R53  2k  [r0402]
R54  10k  [r0402]
R55  0R  [r0402]
R56  0R  [r0402]
R57  10k  [r0402]
R58  10k  [r0402]
R59  10k  [r0402]
R60  10k  [r0402]
R61  10k  [r0402]
R62  10k  [r0402]
R63  10k  [r0402]
R64  10k  [r0402]
R65  NC  [r0402]
R66  10k  [r0402]
R67  10k  [r0402]
R68  10k  [r0402]
R69  10k  [r0402]
SW1  TS-1185-B-A-B-A  [SW-SMD_L4.0-W3.0-LS5.0]
SW2  TS36CA-0.6 250gf 031  [SW-SMD_SHOU_TS36CA-0.6]
SW3  TS36CA-0.6 250gf 031  [SW-SMD_SHOU_TS36CA-0.6]
U9  XC6206P182MR  [SOT-23-3_L3.0-W1.7-P0.95-LS2.9-BR]
U10  MT9700  [SOT-23-5_L3.0-W1.7-P0.95-LS2.8-BR]
U11  CH342K  [ESSOP-10-EP]
U12  PRTR5V0U2X  [SOT143L]
U13  MT9700  [SOT-23-5_L3.0-W1.7-P0.95-LS2.8-BR]
U14  TL8821/TL8189  [qfn44-0.9mm-12x12mm]
U15  TF卡座  [TF2]
Y3  NC/26Mhz±10ppm  [XTAL_3225]
sheet Power-K230
B3  120R@100MHz  [R0201]
B4  120R@100MHz  [R0201]
C93  4.7uF  [c0402]
C94  100nF  [C0201]
C95  100nF  [C0201]
C96  100nF  [C0201]
C97  100nF  [C0201]
C98  100nF  [C0201]
C99  100nF  [C0201]
C100  100nF  [C0201]
C101  100nF  [C0201]
C102  100nF  [C0201]
C103  100nF  [C0201]
C104  100nF  [C0201]
C105  100nF  [C0201]
C106  100nF  [C0201]
C107  100nF  [C0201]
C108  100nF  [C0201]
C109  100nF  [C0201]
C110  100nF  [C0201]
C111  100nF  [C0201]
C112  100nF  [C0201]
C113  100nF  [C0201]
C114  4.7uF  [c0402]
C115  100nF  [C0201]
C116  100nF  [C0201]
C117  100nF  [C0201]
C118  100nF  [C0201]
C119  100nF  [C0201]
C120  22uF/10V  [c0603]
C121  22uF/10V  [c0603]
C122  22uF/10V  [c0603]
C123  22uF/10V  [c0603]
C124  47pF  [c0402]
C125  22uF/10V  [c0603]
C126  22uF/10V  [c0603]
C127  22uF/10V  [c0603]
C128  NC  [c0402]
C129  22uF/10V  [c0603]
C130  22uF/10V  [c0603]
C131  47pF  [c0402]
C132  22uF/10V  [c0603]
C133  22uF/10V  [c0603]
C134  22uF/10V  [c0603]
C135  100nF  [c0402]
C136  22uF/10V  [c0603]
C137  22uF/10V  [c0603]
C138  47pF  [c0402]
C139  22uF/10V  [c0603]
C140  22uF/10V  [c0603]
C141  22uF/10V  [c0603]
C142  100nF  [c0402]
C143  22uF/10V  [c0603]
C144  22uF/10V  [c0603]
C145  47pF  [c0402]
C146  22uF/10V  [c0603]
C147  22uF/10V  [c0603]
C148  22uF/10V  [c0603]
C149  100nF  [C0201]
C150  100nF  [c0402]
C151  100nF  [C0201]
C152  100nF  [C0201]
C153  100nF  [C0201]
C154  100nF  [C0201]
C155  100nF  [C0201]
C156  100nF  [C0201]
C157  100nF  [C0201]
C158  100nF  [C0201]
L1  2.2uH/&gt;2A  [3015]
L2  2.2uH/&gt;2A  [3015]
L3  4.7uH/&gt;2A  [3015]
L4  2.2uH/&gt;2A  [3015]
PWR1  LED  [0603_led_smt_nsk]
R34  10k  [r0402]
R35  33.2k  [r0402]
R36  100k  [r0402]
R37  10k  [r0402]
R38  100k  [r0402]
R39  100k  [r0402]
R40  1k  [r0402]
R41  10k  [r0402]
R42  300k  [r0402]
R43  66.5k  [r0402]
R44  10k  [r0402]
R45  200k  [r0402]
R46  100k  [r0402]
U5  TLV62569  [SOT23-5]
U6  TLV62569  [SOT23-5]
U7  TLV62569  [SOT23-5]
U8  TLV62569  [SOT23-5]
sheet Video
B1  120R@100MHz  [R0201]
B2  120R@100MHz  [R0201]
C79  4.7uF  [c0402]
C80  4.7uF  [c0402]
C81  10uF  [c0402]
C82  4.7uF  [c0402]
C83  4.7uF  [c0402]
C84  10uF  [c0402]
C85  100nF  [c0402]
C86  4.7uF  [c0402]
C87  4.7uF  [c0402]
C88  100nF  [c0402]
C89  100nF  [C0201]
C90  100nF  [C0201]
C91  100nF  [C0201]
C92  100nF  [C0201]
CAMERA1  BTB-DF30FC-24DS-0.4V(81)  [BTB-DF30FC-24DS-0.4V(81)]
D1  B0520WS  [SOD-523]
D2  B0520WS  [SOD-523]
FPC1  FPC-05F-22PH20  [FPC-SMD_22P-P0.50_FPC-05F-22PH20]
FPC2  FPC-05F-22PH20  [FPC-SMD_22P-P0.50_FPC-05F-22PH20]
J1  FPC0.3-SMT-31P  [FPC0.3-FH26W-31S-0.3SHW]
R19  10k  [r0402]
R20  10k  [r0402]
R21  10k  [r0402]
R22  10k  [r0402]
R23  200R  [r0402]
R24  10k  [r0402]
R25  0R  [r0402]
R26  4.7k  [r0402]
R27  NC  [r0402]
R28  4.7k  [r0402]
R29  4.7k  [r0402]
R30  4.7k  [r0402]
R31  10k  [r0402]
R32  4.7k  [r0402]
R33  4.7k  [r0402]
U1  XC6206-2.8V  [SOT23-3]
U2  CAM_OV5647  [CAM_OV5647]
U3  XC6206-2.8V  [SOT23-3]
U4  XC6206-1.5V  [SOT23-3]

## Library data of the parts
B1-B6 = BEAD
C1-C5 C8-C10 C16-C88 C120-C148 C150 C159-C210 = CAP
D12 D13 = B0520WS: SOD-323封装 B0520WS; LC_CODE: C475610; Origin Footprint 2: SMT_DIODE_SOD_123; Origin Footprint 1: SOD-323; Design Item ID: DIODE; Library Name: ZX_MyLib
HDMI1 = HDMI-MH: HDMI-MH 标准母座连接器; LC_CODE: C2858275; Library Name: ZX_MyLib
R1-R90 = RES
T1 = TestPoint: Origin Footprint 2: TestPoint_D40; Origin Footprint 3: TestHole_D60d30; Library Name: ZX_MyLib
U16 U17 = TPD4E05U06: 防静电IC TPD4E05U06DQAR; LC_CODE: C587162; Library Name: ZX_MyLib
U18 = LT9611: 龙讯 LT9611; Library Name: ZX_MyLib
U19 = Magnetics_10/100_BaseT: 10/100 以太网变压器; LC_CODE: C3003215; Library Name: ZX_MyLib
U20 = RJ45-8P
U21 = RTL8152B-VB-CG: Library Name: ZX_MyLib
Y2-Y5 = CRYSTAL2
C6 C7 C11-C15 C89-C119 C149 C151-C158 = 0201_CAP
JP1 = HEADER_2x20_H_F_2.54MM: 2x20 水平排序排针,2.54mm间距
U22 = K230_LP4
Y1 = CRYSTAL: Part Number: *
U23 = K4F8E304HB-MGCJ: LPDDR4-x32; Supplier Part: C2803257; Supplier Footprint: TFBGA-200; JLCPCB Part Class: Extended Part; Supplier: LCSC
ANT1 = CA-C03: Supplier Part: C2838842; Supplier Footprint: 5520; Datasheet: 2021-06-05/34112A/eaa7f794ae26492fadde70fdd3fe967f/CA-C03应用手册.pdf; Supplier: LCSC
AUDIO1 = Audio_PJ-3220: audio jack; LC_CODE: C692442; Library Name: ZX_MyLib
D3 D6-D11 = DIODE_TVS_B_SOD_523: Part Number: A1508000002; Origin Footprint 2: SMT_DIODE_SOD_523
D4 = WS2812B_B
D1 D2 D5 = Diode
J2 J3 = USB_TYPE_C
L1-L6 = Inductor
MIC1 = B4012AP422-003: LCSC Part Name: 驻极体电容φ4.0*1.2mm 1.1V-10V 灵敏度-42dB; Supplier Part: C233791; Manufacturer: Goertek(歌尔); Supplier Footprint: 插件; JLCPCB Part Class: 扩展库; Datasheet: https://atta.szlcsc.com/upload/public/pdf/source/20180813/C233791_EB931036CBE94BDAE55CF8920DD0A876.pdf; Supplier: LCSC
Q1 = BSS138_C400505: 类型:N沟道;漏源电压(Vdss):50V;连续漏极电流(Id):340mA;功率(Pd):360mW;导通电阻(RDS(on)@Vgs,Id):2.5Ω@10V,300mA;; LCSC Part Name: N沟道 50V 340mA; Supplier Part: C400505; Manufacturer: YANGJIE(扬杰); Supplier Footprint: SOT-23; JLCPCB Part Class: 扩展库; Datasheet: https://atta.szlcsc.com/upload/public/pdf/source/20190626/C400505_FE75FEF90CE41A03BE6F9CFDB099470C.pdf; Supplier: LCSC; Type: N沟道; Drain Source Voltage (Vdss): 50V; Continuous Drain Current (Id): 340mA; Power Dissipation (Pd): 360mW; Drain Source On Resistance (RDS(on)@Vgs,Id): 2.5Ω@10V,300mA; Gate Threshold Voltage (Vgs(th)@Id): 1.2V@250uA
SW1 = TS-1185-B-A-B-A: 触点电流:50mA;额定电压(DC):12V;绝缘电阻:-;电路结构:单刀单掷;安装方式:立贴;带灯:无;作用力:160gf;机械寿命:10万次;带支架:否;; LCSC Part Name: 4*3*2mm 立贴 轻触开关; Supplier Part: C561517; Manufacturer: XKB Connectivity(中国星坤); Supplier Footprint: SMD; JLCPCB Part Class: 扩展库; Datasheet: https://atta.szlcsc.com/upload/public/pdf/source/20211011/C2F26DC0AE1820400F54DBF49644F5A1.pdf; Supplier: LCSC; Contact Current: 50mA; Voltage Rating (DC): 12V; Circuit: 单刀单掷; Mounting Style: 立贴; Actuator Style: 圆形按钮; Actuator/Cap Color: 黑色; With Lamp: 无; Operating Force: 160gf; Mechanical Life: 10万次; Operating Temperature: -30℃~+85℃; Switch Length: 4mm; Switch Width: 3mm; Switch Height: 2mm; Strike Gundam: 否
SW2 SW3 = TS36CA-0.6 250gf 031: 触点电流:50mA;额定电压(DC):12V;绝缘电阻:100MΩ;电路结构:单刀单掷;安装方式:卧贴;按钮形状:矩形按钮;按钮/盖帽颜色:黑色;作用力:250gf@±50gf;机械寿命:20000;工作温度:-20℃~+70℃;引脚样式:SMD接片;开关高度:3.5mm;; LCSC Part Name: 轻触开关 3*6*3.5侧按 直径0.6定位柱 白体黑头 250力度; Supplier Part: C2906288; Manufacturer: SHOU HAN(首韩); Supplier Footprint: SMD; JLCPCB Part Class: 扩展库; Datasheet: https://atta.szlcsc.com/upload/public/pdf/source/20211019/6ADEB9DDDDC9A3F33622EA615D016ED7.pdf; Supplier: LCSC; Contact Current: 50mA; Voltage Rating (DC): 12V; Insulation Resistance: 100MΩ; Circuit: 单刀单掷; Mounting Style: 卧贴; Actuator Style: 矩形按钮; Actuator/Cap Color: 黑色; Operating Force: 250gf@±50gf; Mechanical Life: 20000; Operating Temperature: -20℃~+70℃; Pin Style: SMD接片; Switch Height: 3.5mm
U9 = XC6206P182MR_C347373: 输出类型:固定;最大输入电压:8V;输出电压:1.8V;输出电流:250mA;电源纹波抑制比(PSRR):40dB@(1kHz);输出极性:正;; LCSC Part Name: 输入8V 输出1.8V 250mA; Supplier Part: C347373; Manufacturer: UMW(友台半导体); Supplier Footprint: SOT-23; JLCPCB Part Class: 扩展库; Datasheet: https://atta.szlcsc.com/upload/public/pdf/source/20231109/6B10DA60E52FC900BF97E3EFEB5D6341.pdf; Supplier: LCSC; Output Type: 固定; Maximum Input Voltage: 8V; Output Voltage: 1.8V; Output Current: 250mA; Power Supply Rejection Ratio (PSRR): 40dB@(1kHz); Dropout Voltage: 280mV@(50mA); Output Polarity: 正; Number of Outputs: 1
U10 U13 = MT9700: 低功耗负载开关/USB电源开关/限流保护开关; Supplier Part: C89855; Manufacturer: 西安航天民芯; Supplier Footprint: SOT-23-5; JLCPCB Part Class: 扩展库; Datasheet: https://atta.szlcsc.com/upload/public/pdf/source/20170418/1492481333031.pdf; Supplier: LCSC
U11 = CH342K
U12 = PRTR5V0U2X: Part Number: A0412000073; LC_CODE: C2827688; Origin Footprint 2: sot143m; Origin Footprint 3: sot143n; Library Name: ZX_MyLib111
U14 = AP6212
U15 = TF: Part Number: A1503000013
PWR1 = LED
U5-U8 = TLV62569DBVR
CAMERA1 = BTB-DF30FC-24DS-0.4V(81): LC_CODE: C5137456; Origin Footprint 2: 12PINX2; Origin Footprint 3: DF30FC-24DS-0.4V(81); Design Item ID: HEADER 12X2_V; Library Name: ZX_MyLib
FPC1 FPC2 = FPC-05F-22PH20: 间距:0.5mm;触点数量:22P;锁定特性:翻盖式;触点类型:下接;安装类型:卧贴;工作温度范围:-25℃~+85℃;; LCSC Part Name: 间距:0.5mm P数:22P 翻盖式 下接; Supplier Part: C2856804; Manufacturer: XUNPU(讯普); Supplier Footprint: SMD,P=0.5mm,卧贴; Datasheet: https://atta.szlcsc.com/upload/public/pdf/source/20210922/C2856804_675295370E4BEA18823604D875A4450B.pdf; Supplier: LCSC; Pitch: 0.5mm; Number of Contacts: 22P; Locking Feature: 翻盖式; FFC, FCB Thickness: 0.3mm; Contact Type: 下接; Mounting Type: 卧贴; Height Above Board: 2mm; Operating Temperature Range: -25℃~+85℃
J1 = FPC0.3-SMT-31P
U1 U3 = XC6206-2.8V: XC6206 2.8V; LC_CODE: C2892669; Design Item ID: XC6206; Library Name: ZX_MyLib
U2 = CAM_OV5647
U4 = XC6206-1.5V: XC6206 1.5V; LC_CODE: C236709; Design Item ID: XC6206; Library Name: ZX_MyLib

## Nets
AVDD0P8_MIPI: B2.2 C91.2 C92.2 U22.N6(AVDD0P8_MIPI) U22.R8(AVDD0P8_MIPI)
AVDD1P8_MIPI: B1.2 C89.1 C90.1 U22.N7(AVDD1P8_MIPI) U22.R9(AVDD1P8_MIPI)
AVDD10: C205.1 C206.1 C207.1 C208.1 U21.9(U2VDD10) U21.16(DVDD10) U21.23(AVDD10)
AVDD33: C202.1 C203.1 C204.1 U21.1(AVDD33) U21.10(AVDD33) U21.13(DVDD33)
AVDD_0V8_PLL: B3.2 C149.1 U22.G11(AVDD0P8_PLL)
AVDD_2V8: C80.1 C81.1 CAMERA1.19 U1.2(OUT)
DVDD10_UPS: C209.1 C210.1 U21.12(DVDD10_UPS)
DVDD_2V8: C83.1 C84.1 CAMERA1.18 R19.1 R20.1 R22.2 R25.1 U3.2(OUT)
GND: AUDIO1.2(GND) C1.1 C2.1 C3.1 C4.1 C5.2 C6.2 C7.2 C8.2 C9.2 C10.2 C11.2 C12.2 C13.2 C14.2 C15.2 C16.2 C17.2 C18.2 C19.2 C20.2 C21.2 C22.2 C23.2 C24.2 C25.2 C26.2 C27.2 C28.2 C30.2 C31.2 C32.2 C33.2 C34.2 C35.2 C36.2 C37.2 C38.2 C39.2 C40.2 C41.2 C42.2 C43.2 C44.2 C45.2 C46.2 C47.2 C48.2 C49.2 C50.2 C51.2 C52.2 C53.2 C54.2 C55.2 C56.2 C57.2 C58.2 C59.2 C60.2 C61.2 C62.2 C63.2 C64.2 C65.2 C66.2 C67.2 C68.2 C69.2 C70.2 C71.2 C72.2 C73.2 C74.2 C75.2 C76.2 C77.2 C78.2 C79.2 C80.2 C81.2 C82.2 C83.2 C84.2 C85.2 C86.2 C87.2 C88.2 C89.2 C90.2 C91.1 C92.1 C93.2 C94.2 C95.2 C96.2 C97.2 C98.2 C99.2 C100.2 C101.2 C102.2 C103.2 C104.2 C105.2 C106.2 C107.2 C108.2 C109.2 C110.2 C111.2 C112.2 C113.2 C114.2 C115.2 C116.2 C117.2 C118.2 C119.2 C120.2 C121.2 C122.2 C123.2 C125.2 C126.2 C127.2 C128.1 C129.2 C130.2 C132.2 C133.2 C134.2 C135.1 C136.2 C137.2 C139.2 C140.2 C141.2 C142.1 C143.2 C144.2 C146.2 C147.2 C148.2 C149.2 C150.1 C151.2 C152.2 C153.2 C154.2 C155.2 C156.2 C157.2 C158.2 C159.1 C160.2 C161.2 C162.2 C163.1 C164.1 C168.2 C169.2 C170.1 C172.2 C173.2 C174.1 C175.1 C176.2 C177.2 C178.2 C179.2 C180.2 C181.2 C182.2 C183.2 C184.2 C185.2 C186.2 C187.2 C188.2 C189.2 C190.2 C191.2 C192.2 C193.2 C194.2 C195.2 C196.2 C198.2 C199.2 C200.2 C201.2 C202.2 C203.2 C204.2 C205.2 C206.2 C207.2 C208.2 C209.2 C210.2 CAMERA1.20 CAMERA1.22 CAMERA1.24 D3.2(K) D4.1(GND) D6.2(K) D7.2(K) D8.2(K) D9.2(K) D10.2(K) D11.2(K) FPC1.4 FPC1.7 FPC1.10 FPC1.13 FPC1.16 FPC1.19 FPC1.22 FPC1.23 FPC1.24 FPC2.4 FPC2.7 FPC2.10 FPC2.13 FPC2.16 FPC2.19 FPC2.22 FPC2.23 FPC2.24 HDMI1.2(S) HDMI1.5(S_1) HDMI1.8(S_0) HDMI1.11(S_C) HDMI1.17(DDC/CECG) HDMI1.20(GND) HDMI1.21(GND) HDMI1.22(GND) HDMI1.23(GND) J1.2 J1.8 J1.9 J1.11 J1.13 J1.14 J1.20 J1.23 J1.26 J1.29 J1.31 J1.32 J1.33 J2.A1(GND0) J2.A12(GND1) J2.B1(GND3) J2.B12(GND2) J2.P1 J2.P2 J2.P3 J2.P4 J3.A1(GND0) J3.A12(GND1) J3.B1(GND3) J3.B12(GND2) J3.P1 J3.P2 J3.P3 J3.P4 JP1.2 JP1.4 JP1.37 L5.1 MIC1.2(GND) PWR1.2(K) Q1.2(S) R2.2 R3.2 R4.2 R11.2 R12.2 R14.2 R18.2 R21.2 R23.1 R36.2 R39.2 R43.2 R46.2 R47.2 R48.2 R51.1 R53.2 R70.1 R79.2 R81.1 R90.1 SW1.1 SW2.3 SW2.4 SW3.1 SW3.3 SW3.4 U1.1(VSS) U3.1(VSS) U4.1(VSS) U5.2(GND) U6.2(GND) U7.2(GND) U8.2(GND) U9.1(VSS) U10.2(GND) U11.3(GND) U11.11(GND) U12.1(GND) U13.2(GND) U14.1(GND) U14.3(GND) U14.20(GND) U14.31(GND) U14.33(GND) U14.36(GND) U15.6(VSS) U15.10(~WP~) U15.11(GND) U15.12(GGND) U15.13(GGND) U16.3(GND) U16.8(GND) U17.3(GND) U17.8(GND) U18.65(EPAD) U21.6(U2GND) U21.25(GND) U22.A9(TEST_EN) U22.A13(VSS) U22.A16(VSS) U22.A19(VSS) U22.B13(VSS) U22.B20(VSS) U22.C13(VSS) U22.D9(VSS) U22.D10(VSS) U22.D11(VSS) U22.D13(VSS) U22.D15(VSS) U22.E4(VSS) U22.E6(VSS) U22.E7(VSS) U22.E8(VSS) U22.E12(VSS) U22.E13(VSS) U22.E14(VSS) U22.E15(VSS) U22.E16(VSS) U22.E19(VSS) U22.F4(VSS) U22.F6(VSS) U22.F10(VSS) U22.F11(AVSS) U22.F16(VSS) U22.G6(VSS) U22.G7(AVSS) U22.G8(AVSS) U22.G13(VSS) U22.G14(VSS) U22.G15(VSS) U22.G16(VSS) U22.H7(VSS) U22.H11(VSS) U22.H13(VSS) U22.H15(VSS) U22.H16(VSS) U22.H20(VSS) U22.J7(VSS) U22.J11(VSS) U22.J13(VSS) U22.J15(VSS) U22.K3(VSS) U22.K6(VSS) U22.K8(VSS) U22.K10(VSS) U22.K12(VSS) U22.K14(VSS) U22.K16(VSS) U22.K18(VSS) U22.L7(VSS) U22.L8(VSS) U22.L10(VSS) U22.L12(VSS) U22.L15(VSS) U22.L19(VSS) U22.M6(VSS) U22.M8(VSS) U22.M10(VSS) U22.M12(VSS) U22.M15(VSS) U22.M16(VSS) U22.N3(VSS) U22.N5(VSS) U22.N8(VSS) U22.N10(VSS) U22.N12(VSS) U22.N15(VSS) U22.N16(VSS) U22.P6(VSS) U22.P7(VSS) U22.P8(VSS) U22.P10(VSS) U22.P12(VSS) U22.P14(VSS) U22.P15(VSS) U22.P20(VSS) U22.R3(VSS) U22.R6(VSS) U22.R7(VSS) U22.R10(VSS) U22.R12(VSS) U22.R14(VSS) U22.R16(VSS) U22.T3(VSS) U22.T7(VSS) U22.T8(VSS) U22.T9(VSS) U22.T15(VSS) U22.U3(VSS) U22.U8(VSS) U22.U19(VSS) U22.V3(VSS) U22.V4(VSS) U22.V5(VSS) U22.V6(VSS) U22.V7(VSS) U22.V8(VSS) U22.W1(VSS) U22.W16(VSS) U22.W20(VSS) U22.Y13(VSS) U22.Y19(VSS) U23.A3(VSS) U23.A10(VSS) U23.AB3(VSS) U23.AB5(VSS) U23.AB8(VSS) U23.AB10(VSS) U23.C1(VSS) U23.C5(VSS) U23.C8(VSS) U23.C12(VSS) U23.D2(VSS) U23.D4(VSS) U23.D9(VSS) U23.D11(VSS) U23.E1(VSS) U23.E5(VSS) U23.E8(VSS) U23.E12(VSS) U23.G1(VSS) U23.G3(VSS) U23.G5(VSS) U23.G8(VSS) U23.G10(VSS) U23.G12(VSS) U23.J1(VSS) U23.J3(VSS) U23.J10(VSS) U23.J12(VSS) U23.K2(VSS) U23.K4(VSS) U23.K9(VSS) U23.K11(VSS) U23.N2(VSS) U23.N4(VSS) U23.N9(VSS) U23.N11(VSS) U23.P1(VSS) U23.P3(VSS) U23.P10(VSS) U23.P12(VSS) U23.T1(VSS) U23.T3(VSS) U23.T5(VSS) U23.T8(VSS) U23.T10(VSS) U23.T12(VSS) U23.V1(VSS) U23.V5(VSS) U23.V8(VSS) U23.V12(VSS) U23.W2(VSS) U23.W4(VSS) U23.W9(VSS) U23.W11(VSS) U23.Y1(VSS) U23.Y5(VSS) U23.Y8(VSS) U23.Y12(VSS) Y2.2 Y2.4 Y3.2 Y3.4 Y4.2 Y4.4 Y5.2 Y5.4
PGND: C197.2 R90.2 U20.13(GND) U20.14(GND)
VDD0V8_CORE: B2.1 B3.1 C93.1 C94.1 C95.1 C96.1 C97.1 C98.1 C99.1 C100.1 C101.1 C102.1 C103.1 C104.1 C105.1 C106.1 C107.1 C108.1 C109.1 C110.1 C111.1 C112.1 C113.1 C124.1 C125.1 C126.1 C127.1 L1.2 R35.1 U22.F12(VDD0P8_CORE) U22.G9(VDD0P8_CORE) U22.G10(VDD0P8_CORE) U22.G12(VDD0P8_CPU) U22.H8(VDD0P8_KPU) U22.H9(VDD0P8_KPU) U22.H10(VDD0P8_KPU) U22.H12(VDD0P8_CPU) U22.J8(VDD0P8_KPU) U22.J9(VDD0P8_KPU) U22.J10(VDD0P8_KPU) U22.J12(VDD0P8_CPU) U22.K9(VDD0P8_CORE) U22.K11(VDD0P8_CORE) U22.K13(VDD0P8_DDR_CORE) U22.L9(VDD0P8_CORE) U22.L11(VDD0P8_CORE) U22.L13(VDD0P8_DDR_CORE) U22.M9(VDD0P8_CORE) U22.M11(VDD0P8_CORE) U22.M13(VDD0P8_DDR_CORE) U22.N9(VDD0P8_CORE) U22.N11(VDD0P8_CORE) U22.N13(VDD0P8_DDR_CORE) U22.P9(VDD0P8_CORE) U22.P11(VDD0P8_CORE) U22.P13(VDD0P8_CORE)
VDD_1V1: C29.1 C30.1 C31.1 C32.1 C33.1 C34.1 C35.1 C36.1 C37.1 C38.1 C39.1 C40.1 C41.1 C42.1 C43.1 C44.1 C45.1 C46.1 C49.1 C50.1 C51.1 C52.1 C53.1 C54.1 C55.1 C56.1 C57.1 C58.1 C59.1 C60.1 C61.1 C62.1 C63.1 C64.1 C65.1 C66.1 C67.1 C68.1 C69.1 C70.1 C71.1 C72.1 C73.1 C74.1 C75.1 C76.1 C77.1 C78.1 C114.1 C115.1 C116.1 C117.1 C118.1 C119.1 C131.1 C132.1 C133.1 C134.1 L2.2 R13.2 R15.2 R16.2 R17.1 R38.1 U22.H14(VDDIO_DDR) U22.J14(VDDIO_DDR) U22.L14(VDDIO_DDR) U22.M14(VDDIO_DDR) U22.N14(VDDIO_DDR) U23.A4(VDD2) U23.A9(VDD2) U23.AA3(VDDQ) U23.AA5(VDDQ) U23.AA8(VDDQ) U23.AA10(VDDQ) U23.AB4(VDD2) U23.AB9(VDD2) U23.B3(VDDQ) U23.B5(VDDQ) U23.B8(VDDQ) U23.B10(VDDQ) U23.D1(VDDQ) U23.D5(VDDQ) U23.D8(VDDQ) U23.D12(VDDQ) U23.F3(VDDQ) U23.F5(VDD2) U23.F8(VDD2) U23.F10(VDDQ) U23.H1(VDD2) U23.H5(VDD2) U23.H8(VDD2) U23.H12(VDD2) U23.K1(VDD2) U23.K3(VDD2) U23.K10(VDD2) U23.K12(VDD2) U23.N1(VDD2) U23.N3(VDD2) U23.N10(VDD2) U23.N12(VDD2) U23.R1(VDD2) U23.R5(VDD2) U23.R8(VDD2) U23.R12(VDD2) U23.U3(VDDQ) U23.U5(VDD2) U23.U8(VDD2) U23.U10(VDDQ) U23.W1(VDDQ) U23.W5(VDDQ) U23.W8(VDDQ) U23.W12(VDDQ)
VDD_1V5: C87.1 C88.1 CAMERA1.17 U4.2(OUT)
VDD_1V8: B1.1 B4.1 B5.1 B6.1 C6.1 C7.1 C16.1 C17.1 C18.1 C19.1 C20.1 C21.1 C22.1 C23.1 C24.1 C25.1 C26.1 C27.1 C28.1 C145.1 C146.1 C147.1 C148.1 C154.1 C155.1 C156.1 C186.1 C187.1 L4.2 R7.1 R8.1 R9.1 R45.1 U18.11(VDD) U18.36(VDD) U22.E11(VDD1P8) U22.F7(AVDD1P8_CODEC) U22.F8(AVDD1P8_ADC) U22.F9(AVDD1P8_USB) U22.F13(VDD1P8) U23.F1(VDD1) U23.F12(VDD1) U23.G4(VDD1) U23.G9(VDD1) U23.T4(VDD1) U23.T9(VDD1) U23.U1(VDD1) U23.U12(VDD1)
VDD_1V8_RTC: C157.1 C158.1 C159.2 R10.1 SW2.2 U9.2(VOUT) U22.F14(AVDD1P8_LDO) U22.F15(AVDD1P8_RTC)
VDD_1V8_RX: B5.2 C184.1 C185.1 U18.48(VCC18_RX)
VDD_1V8_TX: B6.2 C190.1 C191.1 U18.19(VCC18_TX)
VDD_3V3: C11.1 C12.1 C13.1 C14.1 C15.1 C79.1 C82.1 C86.1 C138.1 C139.1 C140.1 C141.1 C152.1 C153.1 C176.1 C177.1 C178.1 C179.1 C192.1 C193.1 C194.1 D12.1(A) FPC1.1 FPC2.1 J1.5 J1.7 JP1.3 L3.2 R24.1 R26.1 R27.1 R28.1 R31.1 R32.1 R33.1 R40.1 R42.1 R49.1 R54.1 R57.1 R58.1 R59.1 R60.1 R61.1 R62.1 R63.1 R64.1 R65.1 R66.1 R67.1 R68.1 R69.1 R74.1 R75.1 R76.1 R77.1 R78.1 R82.2 R83.2 R84.1 R85.1 U1.3(IN) U3.3(IN) U4.3(IN) U14.9(VBAT) U14.22(VDDIO) U15.4(VCC) U18.10(VCC33) U18.37(VCC33) U22.E9(AVDD3P3_USB) U22.E10(VDD3P3_SD) U22.H6(VDDIO_BANK3) U22.K7(VDDIO_BANK1) U22.M7(VDDIO_BANK4) U22.R11(VDDIO_BANK2) U22.R13(VDDIO_BANK0) U22.R15(VDDIO_BANK5)
VDD_5V: C120.1 C121.1 C122.1 C123.1 C129.1 C130.1 C136.1 C137.1 C143.1 C144.1 C170.2 C198.1 C199.1 D5.1(A) D13.1(A) FPC1.8 FPC1.9 FPC2.8 FPC2.9 J1.1 J1.3 JP1.1 R5.2 R6.2 R34.1 R37.1 R41.1 R44.1 R71.1 R72.1 U5.4(VIN) U6.4(VIN) U7.4(VIN) U8.4(VIN) U10.1(VOUT) U13.5(VIN) U21.11(VDD5)
24M_XIN: C3.2 R1.1 U22.B8(CLK24M_XIN) Y2.1
24M_XOUT: C4.2 R1.2 U22.A8(CLK24M_XOUT) Y2.3
26MHZ_XIN: C174.2 U14.10(XTAL_IN) Y3.1
26MHZ_XOUT: C175.2 U14.11(XTAL_OUT) Y3.3
32K768_XIN: C1.2 U22.B12(CLK32K768_XIN) Y1.2(P2)
32K768_XOUT: C2.2 U22.A12(CLK32K768_XOUT) Y1.1(P1)
ADC0: JP1.40 U22.C2(ADC_0)
ADC1: JP1.38 U22.D2(ADC_1)
ADC2: JP1.39 U22.B1(ADC_2)
ADC3: U22.G3(ADC_3)
ADC4: FPC1.11 U22.C1(ADC_4)
ADC5: FPC2.11 U22.D1(ADC_5)
BANK0_GPIO2: JP1.11 U22.W15(GPIO2/JTAG_TCK/PULSE_CNTR0)
BANK0_GPIO3: JP1.18 U22.V15(GPIO3/JTAG_TDI/PULSE_CNTR1/UART1_TXD)
BANK0_GPIO4: JP1.13 U22.Y15(GPIO4/JTAG_TDO/PULSE_CNTR2/UART1_RXD)
BANK0_GPIO5: JP1.17 U22.U14(GPIO5/JTAG_TMS/PULSE_CNTR3/UART2_TXD)
BANK0_GPIO6: JP1.20 U22.V14(GPIO6/JTAG_RST/PULSE_CNTR4/UART2_RXD)
BANK1_GPIO14: JP1.34 U22.J5(GPIO14/OSPI_CS/QSPI0_CS0)
BANK1_GPIO15: JP1.8 U22.K1(GPIO15/OSPI_CLK/QSPI0_CLK)
BANK1_GPIO16: JP1.7 U22.K2(GPIO16/OSPI_D0/QSPI1_CS4/QSPI0_D0)
BANK1_GPIO17: JP1.32 U22.K4(GPIO17/OSPI_D1/QSPI1_CS3/QSPI0_D1)
BANK1_GPIO18: JP1.31 U22.K5(GPIO18/OSPI_D2/QSPI1_CS2/QSPI0_D2)
BANK1_GPIO19: JP1.6 U22.L1(GPIO19/OSPI_D3/QSPI1_CS1/QSPI0_D3)
BANK1_GPIO20: JP1.5 U22.L2(GPIO20/OSPI_D4/QSPI1_CS0/PULSE_CNTR0)
BANK2_GPIO26: JP1.19 U22.U11(GPIO26/MMC1_CLK/PDM_CLK)
BANK2_GPIO27: JP1.15 U22.W13(GPIO27/MMC1_CMD/PULSE_CNTR5/PDM_IN0)
BANK2_GPIO28: JP1.22 U22.V12(GPIO28/MMC1_D0/UART3_TXD/PDM_IN1)
BANK2_GPIO29: JP1.24 U22.V11(GPIO29/MMC1_D1/UART3_RXD/3D_CTRL_IN)
BANK2_GPIO30: JP1.21 U22.V10(GPIO30/MMC1_D2/UART3_RTS/3D_CTRL_OUT1)
BANK2_GPIO31: JP1.23 U22.V9(GPIO31/MMC1_D3/UART3_CTS/3D_CTRL_OUT2)
BANK2_GPIO32: JP1.25 U22.U10(GPIO32/IIC0_SCL/IIS_CLK/UART3_TXD)
BANK2_GPIO33: JP1.28 U22.T11(GPIO33/IIC0_SDA/IIS_WS/UART3_RXD)
BANK2_GPIO34: JP1.26 U22.U9(GPIO34/IIC1_SCL/IIS_D_IN0/PDM_IN3/UART3_RTS)
BANK2_GPIO35: D4.2(DIN) JP1.14 R54.2 U22.W12(GPIO35/IIC1_SDA/IIS_D_OUT0/PDM_IN1/UART3_CTS)
BANK3_GPIO42: JP1.9 U22.H1(GPIO42/UART1_RTS/PWM0/QSPI1_D2)
BANK3_GPIO43: JP1.35 U22.J6(GPIO43/UART1_CTS/PWM1/QSPI1_D3)
BANK3_GPIO44: JP1.10 U22.H2(GPIO44/UART2_TXD/IIC3_SCL/SPI2AXI_CLK)
BANK3_GPIO45: JP1.12 U22.H3(GPIO45/UART2_RXD/IIC3_SDA/SPI2AXI_CS)
BANK3_GPIO46: JP1.33 U22.H4(GPIO46/UART2_RTS/PWM2/IIC4_SCL)
BANK3_GPIO47: JP1.36 U22.H5(GPIO47/UART2_CTS/PWM3/IIC4_SDA)
BANK4_GPIO52: JP1.29 U22.M3(GPIO52/UART3_RTS/PWM4/IIC3_SCL)
BANK4_GPIO53: JP1.30 U22.N4(GPIO53/UART3_CTS/PWM5/IIC3_SDA)
BANK5_GPIO62: JP1.27 U22.T14(GPIO62/M_CLK2/UART3_DE)
BANK5_GPIO63: JP1.16 U22.U15(GPIO63/M_CLK3/UART3_RE)
BOOT0: R8.2 R11.1 SW3.2 U22.C8(GPIO0/BOOT0)
BOOT1: R9.2 R12.1 U22.C9(GPIO1/BOOT1)
CAM0_SCL: FPC1.3 R26.2 U22.G4(GPIO48/UART4_TXD/IIC0_SCL/SPI2AXI_DIN)
CAM0_SDA: FPC1.2 R28.2 U22.G5(GPIO49/UART4_RXD/IIC0_SDA/SPI2AXI_DOUT)
CAM1_SCL: FPC2.3 R32.2 U22.J2(GPIO40/UART1_TXD/IIC1_SCL/QSPI1_D0)
CAM1_SDA: FPC2.2 R33.2 U22.J1(GPIO41/UART1_RXD/IIC1_SDA/QSPI1_D1)
CAM2_RST: D2.2(K) U22.L3(GPIO21/OSPI_D5/QSPI1_CLK/PULSE_CNTR1)
CAM2_SCL: CAMERA1.2 R29.2 U22.W14(GPIO7/PWM2/IIC4_SCL)
CAM2_SDA: CAMERA1.1 R30.2 U22.U12(GPIO8/PWM3/IIC4_SDA)
CSI0_CLK_N: FPC1.15 U22.Y2(MIPI_RX0_CLK_N)
CSI0_CLK_P: FPC1.14 U22.W2(MIPI_RX0_CLK_P)
CSI0_D0_N: FPC1.21 U22.W3(MIPI_RX0_D0_N)
CSI0_D0_P: FPC1.20 U22.Y3(MIPI_RX0_D0_P)
CSI0_D1_N: FPC1.18 U22.V1(MIPI_RX0_D1_N)
CSI0_D1_P: FPC1.17 U22.V2(MIPI_RX0_D1_P)
CSI1_CLK_N: FPC2.15 U22.W5(MIPI_RX1_CLK_N)
CSI1_CLK_P: FPC2.14 U22.Y5(MIPI_RX1_CLK_P)
CSI1_D2_N: FPC2.21 U22.Y4(MIPI_RX1_D2_N)
CSI1_D2_P: FPC2.20 U22.W4(MIPI_RX1_D2_P)
CSI1_D3_N: FPC2.18 U22.W6(MIPI_RX1_D3_N)
CSI1_D3_P: FPC2.17 U22.Y6(MIPI_RX1_D3_P)
CSI2_CLK_N: CAMERA1.5 U22.R2(MIPI_RX2_CLK_N)
CSI2_CLK_P: CAMERA1.6 U22.R1(MIPI_RX2_CLK_P)
CSI2_D4_N: CAMERA1.3 U22.T1(MIPI_RX2_D4_N)
CSI2_D4_P: CAMERA1.4 U22.T2(MIPI_RX2_D4_P)
CSI2_D5_N: CAMERA1.7 U22.U2(MIPI_RX2_D5_N)
CSI2_D5_P: CAMERA1.8 U22.U1(MIPI_RX2_D5_P)
DDR_CAA0: U22.M19(DDR_CAA0) U23.H2(CA0_a)
DDR_CAA1: U22.L16(DDR_CAA1) U23.J2(CA1_a)
DDR_CAA2: U22.N19(DDR_CAA2) U23.H9(CA2_a)
DDR_CAA3: U22.N20(DDR_CAA3) U23.H10(CA3_a)
DDR_CAA4: U22.M18(DDR_CAA4) U23.H11(CA4_a)
DDR_CAA5: U22.P19(DDR_CAA5) U23.J11(CA5_a)
DDR_CAB0: U22.E20(DDR_CAB0) U23.R2(CA0_b)
DDR_CAB1: U22.G19(DDR_CAB1) U23.P2(CA1_b)
DDR_CAB2: U22.G18(DDR_CAB2) U23.R9(CA2_b)
DDR_CAB3: U22.H17(DDR_CAB3) U23.R10(CA3_b)
DDR_CAB4: U22.F17(DDR_CAB4) U23.R11(CA4_b)
DDR_CAB5: U22.F19(DDR_CAB5) U23.P11(CA5_b)
DDR_CKEA0: U22.N17(DDR_CKEA0) U23.J4(CKE_a)
DDR_CKEB0: U22.J18(DDR_CKEB0) U23.P4(CKE_b)
DDR_CLKA_N: U22.R20(DDR_CLKAN) U23.J9(CK_c_a)
DDR_CLKA_P: U22.R19(DDR_CLKAP) U23.J8(CK_t_a)
DDR_CLKB_N: U22.F20(DDR_CLKBN) U23.P9(CK_c_b)
DDR_CLKB_P: U22.G20(DDR_CLKBP) U23.P8(CK_t_b)
DDR_CSA0: U22.T20(DDR_CSA0) U23.H4(CS_a)
DDR_CSA1: U22.T19(DDR_CSA1)
DDR_CSB0: U22.J20(DDR_CSB0) U23.R4(CS_b)
DDR_DMIA0: U22.V17(DDR_DMIA0) U23.C3(DMIO_a)
DDR_DMIA1: U22.P17(DDR_DMIA1) U23.C10(DMI1_a)
DDR_DMIB0: U22.C15(DDR_DMIB0) U23.Y3(DMI0_b)
DDR_DMIB1: U22.D18(DDR_DMIB1) U23.Y10(DMI1_b)
DDR_DQA0: U22.Y16(DDR_DQA3) U23.B2(DQ0_a)
DDR_DQA1: U22.V16(DDR_DQA2) U23.C2(DQ1_a)
DDR_DQA2: U22.U17(DDR_DQA7) U23.E2(DQ2_a)
DDR_DQA3: U22.T16(DDR_DQA1) U23.F2(DQ3_a)
DDR_DQA4: U22.U16(DDR_DQA0) U23.F4(DQ4_a)
DDR_DQA5: U22.V18(DDR_DQA5) U23.E4(DQ5_a)
DDR_DQA6: U22.W18(DDR_DQA4) U23.C4(DQ6_a)
DDR_DQA7: U22.Y18(DDR_DQA6) U23.B4(DQ7_a)
DDR_DQA8: U22.W19(DDR_DQA12) U23.B11(DQ8_a)
DDR_DQA9: U22.T17(DDR_DQA15) U23.C11(DQ9_a)
DDR_DQA10: U22.P16(DDR_DQA14) U23.E11(DQ10_a)
DDR_DQA11: U22.R17(DDR_DQA8) U23.F11(DQ11_a)
DDR_DQA12: U22.R18(DDR_DQA10) U23.F9(DQ12_a)
DDR_DQA13: U22.T18(DDR_DQA9) U23.E9(DQ13_a)
DDR_DQA14: U22.U18(DDR_DQA13) U23.C9(DQ14_a)
DDR_DQA15: U22.U20(DDR_DQA11) U23.B9(DQ15_a)
DDR_DQB0: U22.A14(DDR_DQB3) U23.AA2(DQ0_b)
DDR_DQB1: U22.A17(DDR_DQB4) U23.Y2(DQ1_b)
DDR_DQB2: U22.C14(DDR_DQB0) U23.V2(DQ2_b)
DDR_DQB3: U22.B14(DDR_DQB2) U23.U2(DQ3_b)
DDR_DQB4: U22.D14(DDR_DQB1) U23.U4(DQ4_b)
DDR_DQB5: U22.B16(DDR_DQB5) U23.V4(DQ5_b)
DDR_DQB6: U22.C16(DDR_DQB6) U23.Y4(DQ6_b)
DDR_DQB7: U22.B17(DDR_DQB7) U23.AA4(DQ7_b)
DDR_DQB8: U22.C18(DDR_DQB12) U23.AA11(DQ8_b)
DDR_DQB9: U22.C17(DDR_DQB15) U23.Y11(DQ9_b)
DDR_DQB10: U22.D17(DDR_DQB13) U23.V11(DQ10_b)
DDR_DQB11: U22.E17(DDR_DQB10) U23.U11(DQ11_b)
DDR_DQB12: U22.E18(DDR_DQB11) U23.U9(DQ12_b)
DDR_DQB13: U22.D16(DDR_DQB14) U23.V9(DQ13_b)
DDR_DQB14: U22.C19(DDR_DQB8) U23.Y9(DQ14_b)
DDR_DQB15: U22.B19(DDR_DQB9) U23.AA9(DQ15_b)
DDR_DQSA0_N: U22.Y17(DDR_DQSA0N) U23.E3(DQS0_c_a)
DDR_DQSA0_P: U22.W17(DDR_DQSA0P) U23.D3(DQS0_t_a)
DDR_DQSA1_N: U22.V19(DDR_DQSA1N) U23.E10(DQS1_c_a)
DDR_DQSA1_P: U22.V20(DDR_DQSA1P) U23.D10(DQS1_t_a)
DDR_DQSB0_N: U22.A15(DDR_DQSB0N) U23.V3(DQS0_c_b)
DDR_DQSB0_P: U22.B15(DDR_DQSB0P) U23.W3(DQS0_t_b)
DDR_DQSB1_N: U22.A18(DDR_DQSB1N) U23.V10(DQS1_c_b)
DDR_DQSB1_P: U22.B18(DDR_DQSB1P) U23.W10(DQS1_t_b)
DDR_RESET: U22.J16(DDR_RESET) U23.T11(RESET_n)
DDR_VREF: C29.2 C47.1 C48.1 R17.2 R18.1 U22.K17(DDR_VREF)
DSI_CLK_N: J1.16 U18.53(MLRXB_DCN) U22.W9(MIPI_TX0_CLK_N)
DSI_CLK_P: J1.18 U18.54(MLRXB_DCP) U22.Y9(MIPI_TX0_CLK_P)
DSI_D0_N: J1.12 U18.52(MLRXB_D2P) U22.Y10(MIPI_TX0_D0_N)
DSI_D0_P: J1.10 U18.51(MLRXB_D2N) U22.W10(MIPI_TX0_D0_P)
DSI_D1_N: J1.4 U18.49(MLRXB_D3N) U22.W11(MIPI_TX0_D1_N)
DSI_D1_P: J1.6 U18.50(MLRXB_D3P) U22.Y11(MIPI_TX0_D1_P)
DSI_D2_N: J1.24 U18.56(MLRXB_D1P) U22.Y8(MIPI_TX1_D2_N)
DSI_D2_P: J1.22 U18.55(MLRXB_D1N) U22.W8(MIPI_TX1_D2_P)
DSI_D3_N: J1.28 U18.57(MLRXB_D0N) U22.W7(MIPI_TX1_D3_N)
DSI_D3_P: J1.30 U18.58(MLRXB_D0P) U22.Y7(MIPI_TX1_D3_P)
GPIO9: FPC1.6 R24.2 U22.T13(GPIO9/PWM4/UART1_TXD/IIC1_SCL)
GPIO10: FPC1.5 U22.U13(GPIO10/3D_CTRL_IN/UART1_RXD/IIC1_SDA)
GPIO11: FPC2.6 R31.2 U22.Y14(GPIO11/3D_CTRL_OUT1/UART2_TXD/IIC2_SCL)
GPIO12: FPC2.5 U22.V13(GPIO12/3D_CTRL_OUT2/UART2_RXD/IIC2_SDA)
GPIO60: FPC2.12 U22.P5(GPIO60/PWM0/IIC0_SCL/QSPI0_CS2/HSYNC1)
GPIO61: FPC1.12 U22.P4(GPIO61/PWM1/IIC0_SDA/QSPI0_CS1/VSYNC1)
HDMI_CEC: HDMI1.13(CEC) R73.1 U18.26(CEC)
HDMI_CLK_N: HDMI1.12(CLK-) U17.5(IO4) U17.6(NC) U18.21(TX_C-)
HDMI_CLK_P: HDMI1.10(CLK+) U17.4(IO3) U17.7(NC) U18.22(TX_C+)
HDMI_CSCL: J1.15 R76.2 U18.34(CSCL) U22.T10(GPIO36/IIC3_SCL/IIS_D_IN1/PDM_IN2/UART4_TXD)
HDMI_CSDA: J1.17 R77.2 U18.35(CSDA) U22.Y12(GPIO37/IIC3_SDA/IIS_D_OUT1/PDM_IN0/UART4_RXD)
HDMI_D0_N: HDMI1.9(D0-) U17.2(IO2) U17.9(NC) U18.24(TX_D0-)
HDMI_D0_P: HDMI1.7(D0+) U17.1(IO1) U17.10(NC) U18.25(TX_D0+)
HDMI_D1_N: HDMI1.6(D1-) U16.5(IO4) U16.6(NC) U18.27(TX_D1-)
HDMI_D1_P: HDMI1.4(D1+) U16.4(IO3) U16.7(NC) U18.28(TX_D1+)
HDMI_D2_N: HDMI1.3(D2-) U16.2(IO2) U16.9(NC) U18.29(TX_D2-)
HDMI_D2_P: HDMI1.1(D2+) U16.1(IO1) U16.10(NC) U18.30(TX_D2+)
HDMI_HPD: HDMI1.19(HOTPLUG) R70.2 U18.13(HPD_GPIO2)
HDMI_INT: J1.19 R75.2 U18.12(INT_ATST_GPIO3) U22.L5(GPIO23/OSPI_D7/QSPI1_D1/PULSE_CNTR3)
HDMI_RSTN: C182.1 J1.21 R74.2 U18.33(RSTN) U22.L6(GPIO24/OSPI_DQS/QSPI1_D2/PULSE_CNTR4)
HDMI_SCL: HDMI1.15(SCL) R72.2 U18.15(DSCL)
HDMI_SDA: HDMI1.16(SDA) R71.2 U18.14(DSDA)
HP_OUTL: C167.1 U22.G1(HP_OUTL)
HP_OUTR: C166.1 U22.G2(HP_OUTR)
INT0: SW2.1 U22.C10(GPIO64/INT0)
INT4: R10.2 U22.C12(GPIO68/INT4)
LCD_EN: J1.27 U22.M1(GPIO25/PWM5/QSPI1_D3/PULSE_CNTR5)
LCD_RST: J1.25 U22.L4(GPIO22/OSPI_D6/QSPI1_D0/PULSE_CNTR2)
LINK_LED: U20.12(G-) U21.15(LED0/SPICSB)
LT9611_XTALI: C188.1 R80.1 U18.18(XTALI) Y4.3
LT9611_XTALO: C189.1 R80.2 U18.17(XTALO) Y4.1
MCLK1: D1.2(K) U22.T12(GPIO13/M_CLK1)
MIC_BIAS: C8.1 R50.1 R52.1 U22.E3(MIC_BIAS)
MIC_NL: C162.1 U22.E2(MIC_NL)
MIC_NR: C173.1 U22.F2(MIC_NR)
MIC_PL: C165.1 U22.E1(MIC_PL)
MIC_PR: C171.1 U22.F1(MIC_PR)
OTG_VBUS_EN: Q1.3(D) R49.2 U13.4(EN)
OUT0: U10.4(EN) U22.B11(GPIO70/OUT0)
RD_N: U19.8(RD-) U21.5(MDIN1)
RD_P: U19.6(RD+) U21.4(MDIP1)
RF_INOUT: R56.2 U14.2(WL_BT_ANT)
RSTN: C5.1 R7.2 SW1.2 U22.B9(RSTN)
RX_N: U19.9(RX-) U20.6(M2-)
RX_P: U19.11(RX+) U20.3(M1+)
RXD0_CH342: U11.9(RXD0) U22.J4(GPIO38/UART0_TXD/QSPI1_CS0/HSYNC0)
RXD1_CH342: U11.6(RXD1) U22.M5(GPIO50/UART3_TXD/IIC2_SCL/QSPI0_CS4)
SPEED_LED: U20.10(Y-) U21.17(LED1/SPISCK)
TD_N: U19.3(TD-) U21.3(MDIN0)
TD_P: U19.1(TD+) U21.2(MDIP0)
TFCARD_CLK: D7.1(A) R58.2 U15.5(CLK/SCLK) U22.N2(GPIO55/QSPI0_CLK/MMC1_CLK/PWM1)
TFCARD_CMD: D6.1(A) R57.2 U15.3(CMD/DI) U22.M2(GPIO54/QSPI0_CS0/MMC1_CMD/PWM0)
TFCARD_D0: D8.1(A) R59.2 U15.7(DAT0/DO) U22.P3(GPIO56/QSPI0_D0/MMC1_D0/PWM2)
TFCARD_D1: D9.1(A) R60.2 U15.8(DAT1/RSV) U22.N1(GPIO57/QSPI0_D1/MMC1_D1/PWM3)
TFCARD_D2: D10.1(A) R61.2 U15.1(DAT2/RSV) U22.P1(GPIO58/QSPI0_D2/MMC1_D2/PWM4)
TFCARD_D3: D11.1(A) R62.2 U15.2(DAT3/CS) U22.P2(GPIO59/QSPI0_D3/MMC1_D3/PWM5)
TX_N: U19.14(TX-) U20.2(M0-)
TX_P: U19.16(TX+) U20.1(M0+)
TXD0_CH342: U11.8(TXD0) U22.J3(GPIO39/UART0_RXD/QSPI1_CLK/VSYNC0)
TXD1_CH342: U11.5(TXD1) U22.M4(GPIO51/UART3_RXD/IIC2_SDA/QSPI0_CS3)
USB0_CC1: D3.1(A) J3.A5(CC1) J3.B5(CC2) Q1.1(G) U22.D3(USB0_ID)
USB0_N: J3.A7(DN1) J3.B7(DN2) U12.2(I/O1) U22.B2(USB0_DN)
USB0_P: J3.A6(DP1) J3.B6(DP2) U12.3(I/O2) U22.A2(USB0_DP)
USB1_N: U21.7(U2DM) U22.A4(USB1_DN)
USB1_P: U21.8(U2DP) U22.B4(USB1_DP)
USB_CC: J2.A5(CC1) J2.B5(CC2) R47.1
USB_N: J2.A7(DN1) J2.B7(DN2) U11.2(UD-)
USB_P: J2.A6(DP1) J2.B6(DP2) U11.1(UD+)
USB_VBUS: C169.1 J3.A4(VBUS0) J3.A9(VBUS1) J3.B4(VBUS3) J3.B9(VBUS2) U12.4(VCC) U13.1(VOUT)
USB_VIN: C160.1 C161.1 J2.A4(VBUS0) J2.A9(VBUS1) J2.B4(VBUS3) J2.B9(VBUS2) U9.3(VIN) U10.5(VIN) U11.4(VDD5)
VAA_DDR: B4.2 C151.1 U22.K15(VAA_DDR)
WIFI_CLK: R65.2 U14.17(SDIO_DATA_CLK) U22.A5(MMC0_CLK)
WIFI_CMD: R66.2 U14.16(SDIO_DATA_CMD) U22.D6(MMC0_CMD)
WIFI_D0: R64.2 U14.18(SDIO_DATA_0) U22.D5(MMC0_D0)
WIFI_D1: R63.2 U14.19(SDIO_DATA_1) U22.C5(MMC0_D1)
WIFI_D2: R68.2 U14.14(SDIO_DATA_2) U22.B5(MMC0_D2)
WIFI_D3: R67.2 U14.15(SDIO_DATA_3) U22.C6(MMC0_D3)
WIFI_REGON: R69.2 U14.12(WL_REG_ON) U22.A6(MMC0_RST_N)
XTAL_IN: C200.1 U21.22(XKXTAL2) Y5.1
XTAL_OUT: C201.1 U21.21(XKXTAL1) Y5.3
$1N6877: C9.1 C10.1 U22.F3(CODEC_VCM)
$1N6883: R3.1 U22.C4(USB1_TXRTUNE)
$1N6885: R4.1 U22.D4(USB0_TXRTUNE)
$1N6887: R5.1 U22.A3(USB1_VBUS)
$1N6889: R6.1 U22.C3(USB0_VBUS)
$1N9693: R2.1 U22.B3(USB1_ID)
$2N24907: R14.1 U22.K19(DDR_ZN)
$2N24909: R13.1 U23.G2(ODT_CA_a)
$2N24911: R15.1 U23.T2(ODT_CA_b)
$2N25660: R16.1 U23.A5(ZQ)
$3N3692: PWR1.1(A) R40.2
$3N3710: C124.2 R35.2 R36.1 U5.5(FB)
$3N3711: L1.1 U5.3(LX)
$3N3712: C131.2 R38.2 R39.1 U6.5(FB)
$3N3714: L2.1 U6.3(LX)
$3N3715: C128.2 R34.2 U5.1(EN)
$3N3716: C135.2 R37.2 U6.1(EN)
$3N3717: C142.2 R41.2 U7.1(EN)
$3N3718: C150.2 R44.2 U8.1(EN)
$3N3719: C145.2 R45.2 R46.1 U8.5(FB)
$3N3720: L4.1 U8.3(LX)
$3N3721: C138.2 R42.2 R43.1 U7.5(FB)
$3N3722: L3.1 U7.3(LX)
$4N2513: R51.2 U13.3(SET)
$4N2560: C171.2 C172.1 MIC1.1(OUT) R52.2 R53.1
$4N2601: L6.1 U14.21(VIN_LDO_OUT)
$4N2602: C180.1 C181.1 L6.2 U14.23(VIN_LDO)
$4N2608: ANT1.2(ANT) R55.1
$4N2644: R48.1 U10.3(SET)
$4N2660: D4.3(VDD) D5.2(K)
$4N3243: AUDIO1.1(MIC) C163.2 C165.2 R50.2
$4N3254: AUDIO1.3(L) C167.2
$4N3256: AUDIO1.4(R) C166.2
$4N29180: L5.2 R55.2 R56.1
$4N43326: C164.2 C168.1 U11.7(VIO) U11.10(V3)
$5N4846: R23.2 U22.U7(MIPI_REXT)
$5N10965: C85.1 CAMERA1.16 D2.1(A) R20.2
$5N10986: CAMERA1.23 D1.1(A) R19.2
$5N21116: R25.2 R27.2 R29.1 R30.1
$5N27856: CAMERA1.13 R21.1 R22.1
$6N1656: R79.1 U18.20(REXT)
$6N1668: C183.1 U18.23(VCOM)
$6N1761: D12.2(K) R73.2
$6N1854: D13.2(K) HDMI1.18(+5V)
$6N1907: T1.TP(TestPoint) U18.9(SCLK_GPIO4)
$6N2102: R78.2 U18.32(ADDR_GPIO0)
$6N3162: R84.2 U21.18(SPISDI/XTALDET)
$6N3165: R85.2 U21.14(GPIO)
$6N3172: R81.2 U21.24(RSET)
$6N3846: R89.1 U20.4(M1-) U20.5(M2+)
$6N3852: R88.1 U20.7(M3+) U20.8(M3-)
$6N3869: R87.1 U19.15(TXCT)
$6N3872: R86.1 U19.10(RXCT)
$6N3875: C196.1 U19.7(RCT)
$6N3878: C195.1 U19.2(TCT)
$6N3905: R82.1 U20.9(Y+)
$6N3909: R83.1 U20.11(G+)
$6N25767: C197.1 R86.2 R87.2 R88.2 R89.2

Not connected (* = marked no-connect by the designer): ANT1 1; CAMERA1 9 10 11 12 14 15 21; D4 4(DOUT); HDMI1 14(NC); J2 A8(SUB1) B8(SUB2); J3 A8(SUB1) B8(SUB2); U14 4(FM_RX) 5(N_WAKE) 6(BT_WAKE) 7(BT_HOST_WAKE) 8(BT_VIO/N_HOST_WAKE) 13(WL_HOST_WAKE) 24(LPO) 25(PCM_OUT) 26(PCM_CLK) 27(PCM_IN) 28(PCM_SYNC) 29(VDD_TCXO) 30(TCXO_IN) 32(GPS_RF) 34(BT_RST_N) 35(N_I2C_SDA) 37(N_I2C_SCL) 38(N_REG_PU) 39(TX2) 40(TX1) 41(UART_RTS_N) 42(UART_TXD) 43(UART_RXD) 44(UART_CTS_N); U15 9(CD/RSV); U18 1(GPIO13) 2(GPIO12) 3(MCLK_GPIO10) 4(SPDIF_SD3_GPIO9) 5(SD2_GPIO8) 6(SD1_GPIO7) 7(SD0_GPIO6) 8(WS_GPIO5) 16(ESDA) 31(ESCL) 38(MLRXA_D3N) 39(MLRXA_D3P) 40(MLRXA_D2N) 41(MLRXA_D2P) 42(MLRXA_DCN) 43(MLRXA_DCP) 44(MLRXA_D1N) 45(MLRXA_D1P) 46(MLRXA_D0N) 47(MLRXA_D0P) 59(GPIO19) 60(GPIO18) 61(GPIO17) 62(GPIO16) 63(GPIO15) 64(GPIO14); U21 19(LANWAKEB) 20(SPISDO); U22 A7(MMC0_D5) A10(GPIO66/INT2) A11(GPIO67/INT3) A20(NC) B6(MMC0_STROBE) B7(MMC0_D6) B10(GPIO65/INT1) C7(MMC0_D7) C11(GPIO71/OUT1) C20(DDR_NC) D7(MMC0_D4) D8(ANA_TS_VTEST) D12(GPIO69/INT5) D19(DDR_NC) D20(DDR_NC) F18(DDR_NC) G17(DDR_NC) H18(DDR_NC) H19(DDR_NC) J17(DDR_CKEB1) J19(DDR_CSB1) K20(DDR_NC) L17(DDR_NC) L18(DDR_NC) L20(DDR_NC) M17(DDR_NC) M20(DDR_NA) N18(DDR_NC) P18(DDR_CKEA1) U6(MIPI_ATB) Y1(NC) Y20(NC)

## Notes on the sheets
sheet 1
- Force Host Mode
- K230D设计有PMU功能，可通过INT管脚检测外部事件，
  然后触发OUT输出，如检测外部按键长按后，OUT控
  制总电源的使能完成系统上电。不需要PMU功能可直
  接将VDD1V8_RTC和系统1V8接到一起即可
  前置条件：VDD1V8_RTC供电，32.768khz晶振提供
  INT0设计为长按3s后OUT0输出高电平
  INT4设计为检测到上拉，OUT0立即输出高电平
- BOOT0 = 0，BOOT1 = 0，SPI Nor
  BOOT0 = 0，BOOT1 = 1，eMMC
  BOOT0 = 1，BOOT1 = 0，SPI Nand
  BOOT0 = 1，BOOT1 = 1，SD Card
sheet 2
- VDD1=1.8V, Imax < 50mA
  VDD2=1.2V, Imax <
  VDDQ=1.2V,
  VDDCA=1.2V,
- 布线等长设计，注意添加pin delay
sheet 3
- Vo = 0.6 * (R1+R2) / R2
- R2 <= 200k
- R1 = (Vo / 0.6 - 1) * R2
- R2 = 0.6 * R1 / (Vo - 0.6)
sheet 4
- PMU供电及控制主电源
sheet 5
- LDO选择可提供300mA的器件
- OV5647
- 01 : SDA
  02 : SCL
  03 : MDN0
  04 : MDP0
  05 : MCN
  06 : MCP
  07 : MDN1
  08 : MDP1
  09 :
  10 :
  11 :
  12 :
- 24 : GND
  23 : MCLK
  22 : GND
  21 : PCLK
  20 : GND
  19 : AVDD
  18 : DOVDD
  17 : DVDD
  16 : RESET
  15 : VSYNC
  14 : HREF
  13 : PWDN
- RGB
- R56 焊接 0R，R57 空焊
- R58和R59 修改为4.7k
sheet 6
- HDMI
- LT9611 swap
sheet 7
- JLC06161H-3313
- 沉金，板厚：1.6mm
